# Altium project Camera-Controller-Board.PrjPcb (part 9 of 18)

## Sheet RK3588-USB-Control.SchDoc
size 420 x 297 mm; SheetNumber: 8; SheetTotal: 22
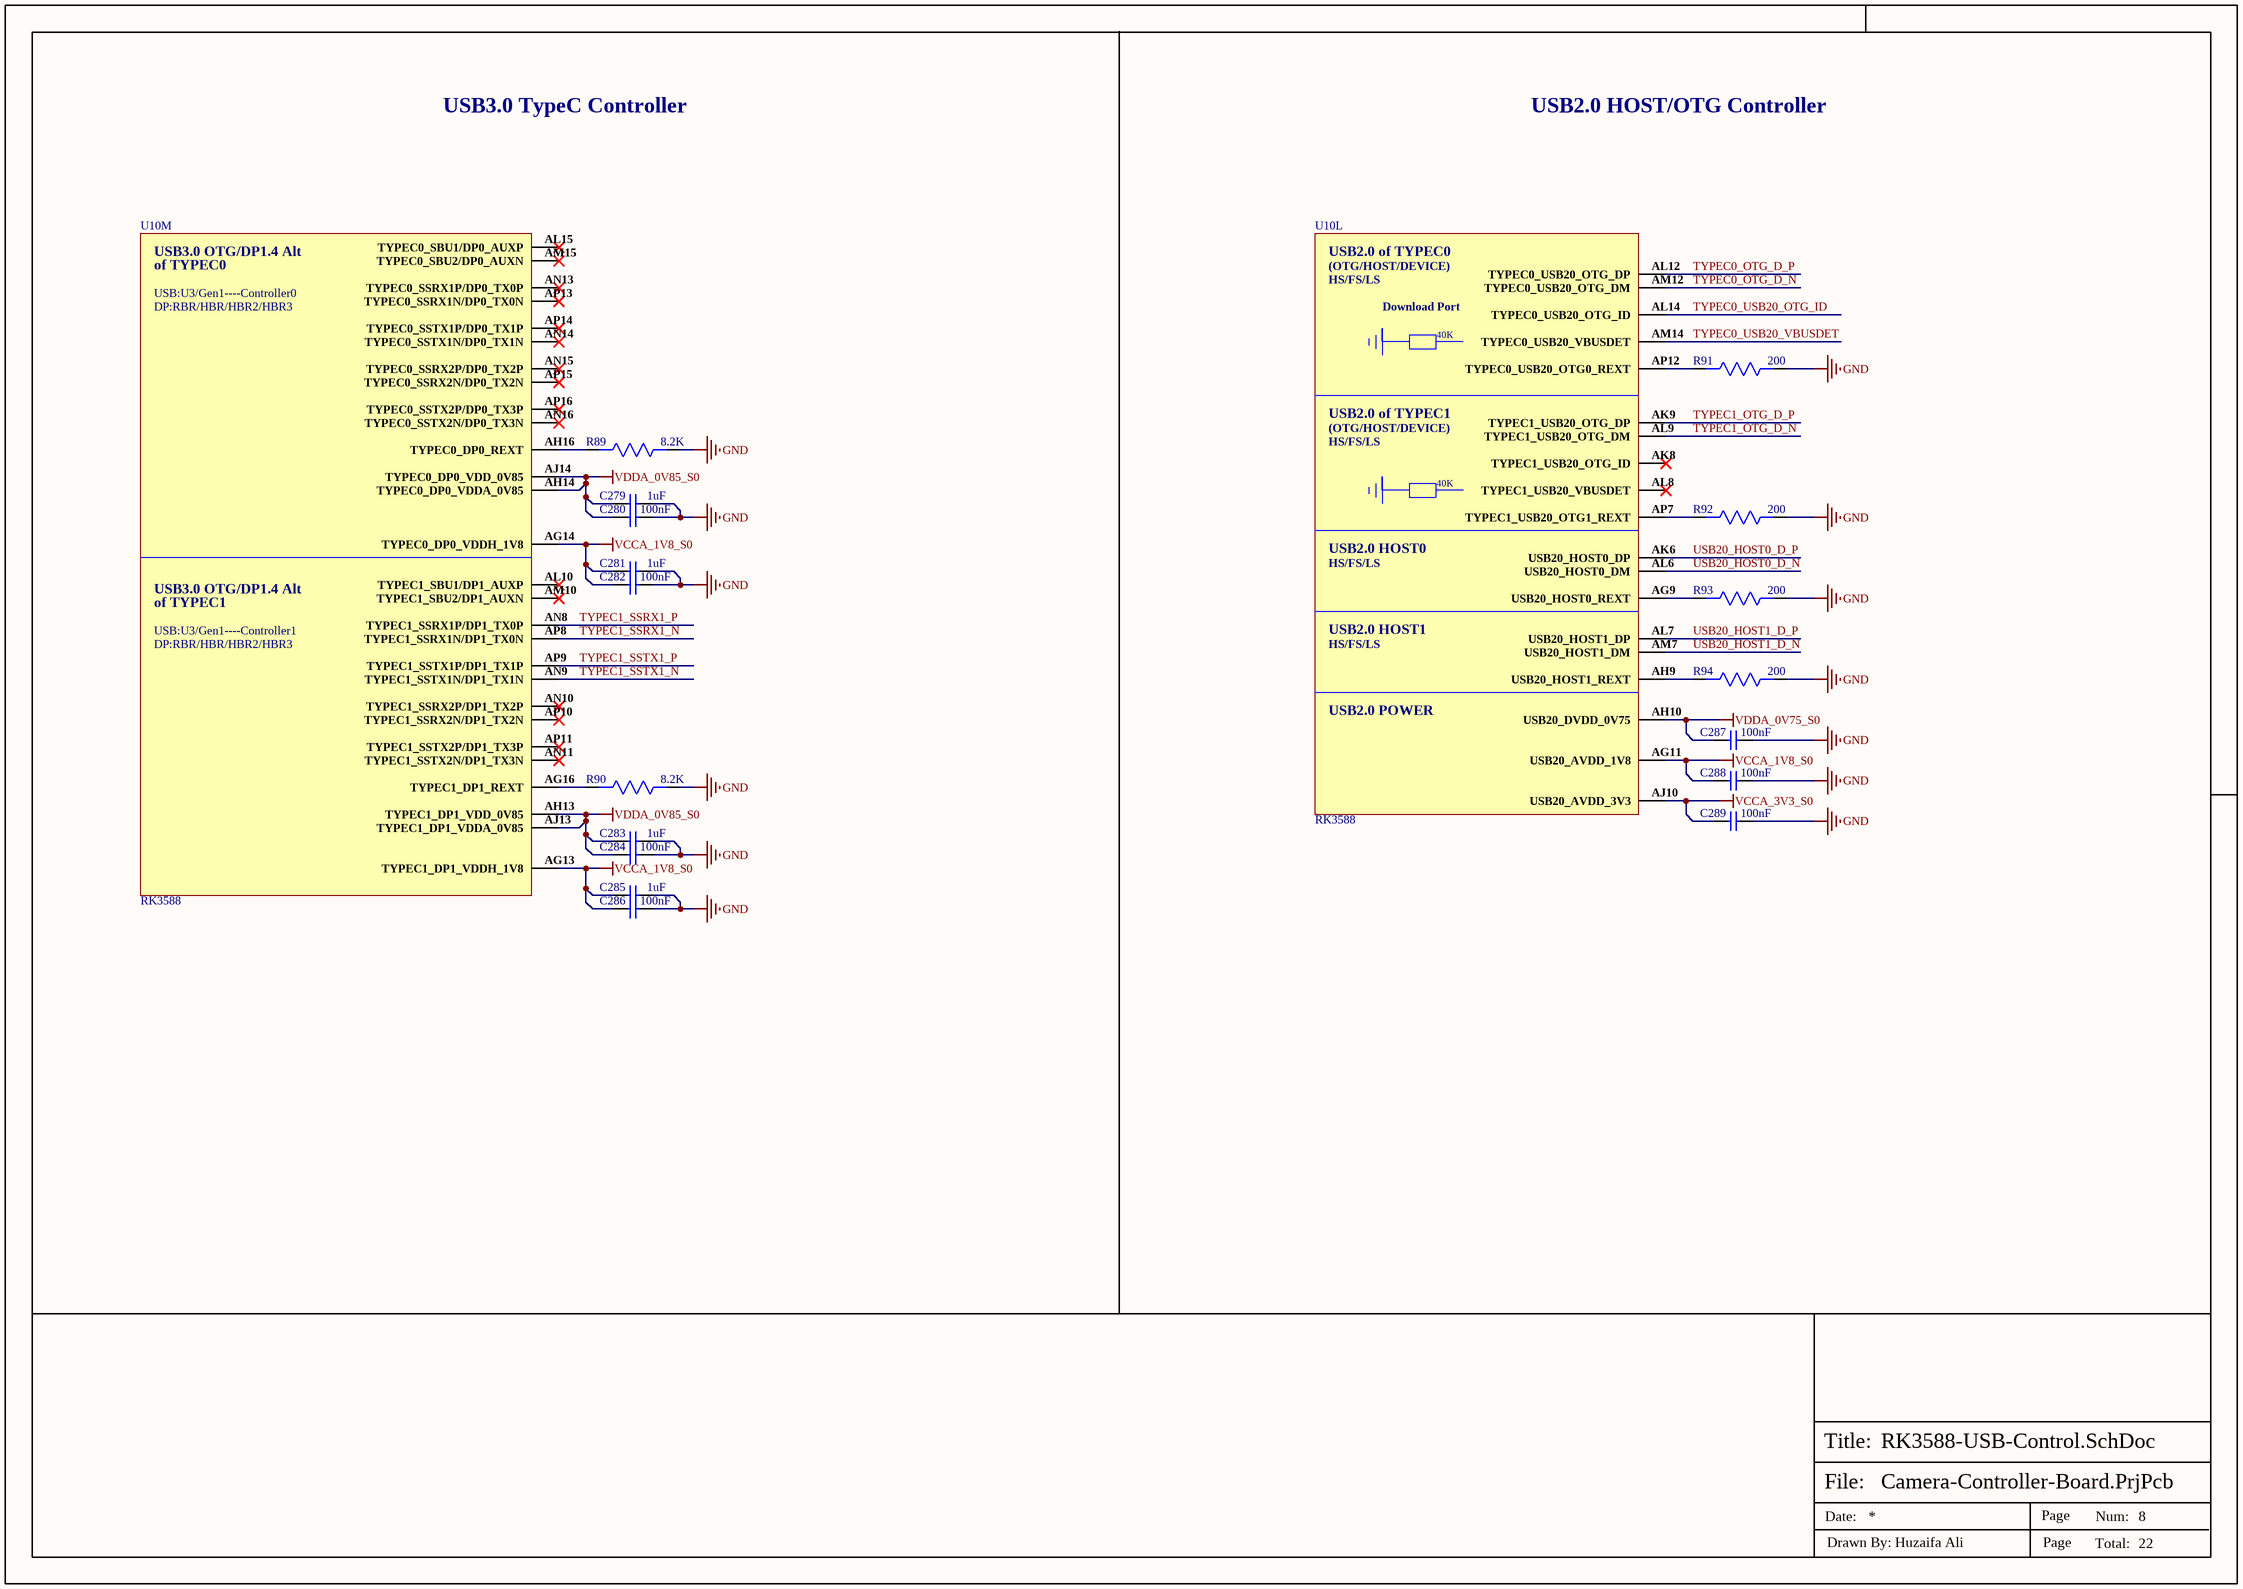
[diagram p7: RK3588-USB-Control.SchDoc]

### Parts
C279  1uF  [CAP-0201]
C280  100nF  [CAP-0201]
C281  1uF  [CAP-0201]
C282  100nF  [CAP-0201]
C283  1uF  [CAP-0201]
C284  100nF  [CAP-0201]
C285  1uF  [CAP-0201]
C286  100nF  [CAP-0201]
C287  100nF  [CAP-0201]
C288  100nF  [CAP-0201]
C289  100nF  [CAP-0201]
R89  8.2K  [Res-0201]
R90  8.2K  [Res-0201]
R91  200  [Res-0201]
R92  200  [Res-0201]
R93  200  [Res-0201]
R94  200  [Res-0201]
U10  RK3588  [FCBGA-1088L]  (parts L,M of 26)

### Nets
GND: C279.2 C280.2 C281.2 C282.2 C283.2 C284.2 C285.2 C286.2 C287.2 C288.2 C289.2 R89.1 R90.1 R91.1 R92.1 R93.1 R94.1
VCCA_1V8_S0: C281.1 C282.1 C285.1 C286.1 C288.1 U10.AG11(USB20_AVDD_1V8) U10.AG13(TYPEC1_DP1_VDDH_1V8) U10.AG14(TYPEC0_DP0_VDDH_1V8)
VCCA_3V3_S0: C289.1 U10.AJ10(USB20_AVDD_3V3)
VDDA_0V75_S0: C287.1 U10.AH10(USB20_DVDD_0V75)
VDDA_0V85_S0: C279.1 C280.1 C283.1 C284.1 U10.AH13(TYPEC1_DP1_VDD_0V85) U10.AH14(TYPEC0_DP0_VDDA_0V85) U10.AJ13(TYPEC1_DP1_VDDA_0V85) U10.AJ14(TYPEC0_DP0_VDD_0V85)
TYPEC0_OTG_D_N: U10.AM12(TYPEC0_USB20_OTG_DM)
TYPEC0_OTG_D_P: U10.AL12(TYPEC0_USB20_OTG_DP)
TYPEC0_USB20_OTG_ID: U10.AL14(TYPEC0_USB20_OTG_ID)
TYPEC0_USB20_VBUSDET: U10.AM14(TYPEC0_USB20_VBUSDET)
TYPEC1_OTG_D_N: U10.AL9(TYPEC1_USB20_OTG_DM)
TYPEC1_OTG_D_P: U10.AK9(TYPEC1_USB20_OTG_DP)
TYPEC1_SSRX1_N: U10.AP8(TYPEC1_SSRX1N/DP1_TX0N)
TYPEC1_SSRX1_P: U10.AN8(TYPEC1_SSRX1P/DP1_TX0P)
TYPEC1_SSTX1_N: U10.AN9(TYPEC1_SSTX1N/DP1_TX1N)
TYPEC1_SSTX1_P: U10.AP9(TYPEC1_SSTX1P/DP1_TX1P)
USB20_HOST0_D_N: U10.AL6(USB20_HOST0_DM)
USB20_HOST0_D_P: U10.AK6(USB20_HOST0_DP)
USB20_HOST1_D_N: U10.AM7(USB20_HOST1_DM)
USB20_HOST1_D_P: U10.AL7(USB20_HOST1_DP)
NetR89_2: R89.2 U10.AH16(TYPEC0_DP0_REXT)
NetR90_2: R90.2 U10.AG16(TYPEC1_DP1_REXT)
NetR91_2: R91.2 U10.AP12(TYPEC0_USB20_OTG0_REXT)
NetR92_2: R92.2 U10.AP7(TYPEC1_USB20_OTG1_REXT)
NetR93_2: R93.2 U10.AG9(USB20_HOST0_REXT)
NetR94_2: R94.2 U10.AH9(USB20_HOST1_REXT)

Not connected (* = marked no-connect by the designer): U10 AK8(TYPEC1_USB20_OTG_ID)* AL8(TYPEC1_USB20_VBUSDET)* AL10(TYPEC1_SBU1/DP1_AUXP)* AL15(TYPEC0_SBU1/DP0_AUXP)* AM10(TYPEC1_SBU2/DP1_AUXN)* AM15(TYPEC0_SBU2/DP0_AUXN)* AN10(TYPEC1_SSRX2P/DP1_TX2P)* AN11(TYPEC1_SSTX2N/DP1_TX3N)* AN13(TYPEC0_SSRX1P/DP0_TX0P)* AN14(TYPEC0_SSTX1N/DP0_TX1N)* AN15(TYPEC0_SSRX2P/DP0_TX2P)* AN16(TYPEC0_SSTX2N/DP0_TX3N)* AP10(TYPEC1_SSRX2N/DP1_TX2N)* AP11(TYPEC1_SSTX2P/DP1_TX3P)* AP13(TYPEC0_SSRX1N/DP0_TX0N)* AP14(TYPEC0_SSTX1P/DP0_TX1P)* AP15(TYPEC0_SSRX2N/DP0_TX2N)* AP16(TYPEC0_SSTX2P/DP0_TX3P)*

### Notes on the sheet
- USB3.0 TypeC Controller
- USB2.0 HOST/OTG Controller
- File:
- Title:
- Date:
- Page
- Num:
- Total:
- Drawn By: Huzaifa Ali
- (in symbol RK3588, part L) USB2.0 of TYPEC0; (OTG/HOST/DEVICE); HS/FS/LS; Download Port; 40K; USB2.0 of TYPEC1; USB2.0 HOST0; USB2.0 HOST1; USB2.0 POWER
- (in symbol RK3588, part M) USB3.0 OTG/DP1.4 Alt; of TYPEC0; USB:U3/Gen1----Controller0; DP:RBR/HBR/HBR2/HBR3; of TYPEC1; USB:U3/Gen1----Controller1

### Library data of the parts
C279 C281 C283 C285 = CC0201KRX5R5BB105: as C230 on sheet RK3588-OSC-PLL-PMUIO; Supplier 1: Digi-Key; Manufacturer Part Number: CC0201KRX5R5BB105; RoHS: Yes; Category: Ceramic Capacitors; Stock 1: 1909543; Pricing 1: 1=0.10000, 10=0.04600, 50=0.02500, 100=0.02050, 500=0.01464, 1000=0.01150, 2500=0.01045, 5000=0.00962 (USD); Mount: Surface Mount; Case/Package: 0201; Case Code (Imperial): 0201; Case Code (Metric): 0603; Min Operating Temperature: -55°C; Max Operating Temperature: 85°C; Packaging: Cut Tape; Capacitance: 1uF; Voltage Rating: 6.3V; RoHS Compliant: Yes; ComponentLink1URL: http://www.yageo.com/documents/recent/UPY-GPHC_X5R_4V-to-50V_25.pdf?src-supplier=Digi-Key; ComponentLink1Description: http://www.yageo.com/documents/recent/UPY-GPHC_X5R_4V-to-50V_25.pdf?src-supplier=Digi-Key; ComponentLink2URL: https://www.yageo.com/upload/media/product/productsearch/datasheet/mlcc/UPY-GPHC_X5R_4V-to-50V_26.pdf?src-supplier=Digi-Key; ComponentLink2Description: https://www.yageo.com/upload/media/product/productsearch/datasheet/mlcc/UPY-GPHC_X5R_4V-to-50V_26.pdf?src-supplier=Digi-Key; Supplier Part Number 1: 311-3471-1-ND
C280 C282 C284 C286-C289 = CC0201KRX5R5BB104: as C244 on sheet RK3588-OSC-PLL-PMUIO; Supplier 1: Digi-Key; Manufacturer Part Number: CC0201KRX5R5BB104; RoHS: Yes; Category: Ceramic Capacitors; Stock 1: 3711589; Pricing 1: 1=0.10000, 10=0.02100, 50=0.01160, 100=0.00960, 500=0.00682, 1000=0.00536, 2500=0.00487, 5000=0.00448 (USD); Mount: Surface Mount; Case/Package: 0201; Number of Pins: 2; Case Code (Imperial): 0201; Case Code (Metric): 0603; Min Operating Temperature: -55°C; Max Operating Temperature: 85°C; Capacitance: 100nF; Dielectric: X5R; Voltage Rating: 6.3V; Packaging: Tape and Reel; Package Quantity: 1; Voltage Rating (DC): 6.3V; Termination: SMD/SMT; Resistor Type: Ceramic; Series: CC; Length: 0.6mm; Width: 0.012inch; Height: 0.3mm; Thickness: 0.013inch; Depth: 0.3mm; Reach SVHC Compliant: Yes; Lead Free: Lead Free; Halogen Free: Halogen Free; RoHS Compliant: Yes; ComponentLink1URL: https://datasheet.ciiva.com/7656/1525783-7656597.pdf?src-supplier=Element14; ComponentLink1Description: https://datasheet.ciiva.com/7656/1525783-7656597.pdf?src-supplier=Element14; ComponentLink2URL: https://datasheet.ciiva.com/28450/1359354-28450200.pdf?src-supplier=Element14; ComponentLink2Description: https://datasheet.ciiva.com/28450/1359354-28450200.pdf?src-supplier=Element14; ComponentLink3URL: https://datasheet.ciiva.com/176/mlccorderingcode-176766.pdf?src-supplier=Digi-Key; ComponentLink3Description: https://datasheet.ciiva.com/176/mlccorderingcode-176766.pdf?src-supplier=Digi-Key; ComponentLink4URL: https://datasheet.ciiva.com/176/mlccorderingcode-176765.pdf?src-supplier=Digi-Key; ComponentLink4Description: https://datasheet.ciiva.com/176/mlccorderingcode-176765.pdf?src-supplier=Digi-Key; ComponentLink5URL: https://datasheet.ciiva.com/176/mlccorderingcode-176767.pdf?src-supplier=Digi-Key; ComponentLink5Description: https://datasheet.ciiva.com/176/mlccorderingcode-176767.pdf?src-supplier=Digi-Key; Supplier Part Number 1: 311-1408-1-ND
R89 R90 = RC0201FR-078K2L: RES 8.2K OHM 1% 1/20W 0201; Manufacturer: Yageo; Resistance: 8.2kR; Power Rating: 50mW; Voltage Rating: 25V; Temperature Coefficient: 200ppm/°C; Supplier 1: Digi-Key; Manufacturer Part Number: RC0201FR-078K2L; RoHS: Yes; Category: Chip SMD Resistors; Stock 1: 282340; Pricing 1: 1=0.10000, 10=0.03700, 100=0.01500, 1000=0.00672, 2500=0.00583, 5000=0.00482 (USD); Case/Package: 0201; Case Code (Metric): 0603; Case Code (Imperial): 0201; Min Operating Temperature: -55°C; Max Operating Temperature: 125°C; Package Quantity: 10000; Packaging: Tape and Reel; Tolerance: 1%; Resistor Type: Thick Film; Number of Terminations: 2; Termination: SMD/SMT; Max Power Dissipation: 50mW; Features: Moisture Resistant; Series: RC; Resistance Tolerance: 1%; Length: 0.024inch; Width: 0.3mm; Height: 0.01inch; Reach SVHC Compliant: Yes; Lead Free: Lead Free; RoHS Compliant: Yes; ComponentLink1URL: https://datasheet.ciiva.com/14985/pyu-r-int-thick-7-14985436.pdf?src-supplier=Digi-Key; ComponentLink1Description: https://datasheet.ciiva.com/14985/pyu-r-int-thick-7-14985436.pdf?src-supplier=Digi-Key; Supplier Part Number 1: YAG2353CT-ND
R91-R94 = RC0201FR-07200RL: RES 200 OHM 1% 1/20W 0201; Manufacturer: Yageo; Resistance: 200R; Voltage Rating: 25V; Power Rating: 50mW; Temperature Coefficient: 200ppm/°C; Supplier 1: Digi-Key; Manufacturer Part Number: RC0201FR-07200RL; RoHS: Yes; Category: Chip SMD Resistors; Stock 1: 400402; Pricing 1: 1=0.10000, 10=0.03700, 100=0.01500, 1000=0.00672, 2500=0.00583, 5000=0.00482 (USD); Case/Package: 0201; Case Code (Imperial): 0201; Case Code (Metric): 0603; Size Code: 0201; Min Operating Temperature: -55°C; Max Operating Temperature: 125°C; Package Quantity: 10000; Tolerance: 1%; Packaging: Tape and Reel; Resistor Type: Thick Film; Termination: SMD/SMT; Number of Terminations: 2; Max Power Dissipation: 50mW; Features: Moisture Resistant; Series: RC; Construction: Rectangular; Length: 0.6mm; Width: 0.3mm; Height: 0.01inch; Depth: 0.3mm; Military Standard: Not; Lead Free: Lead Free; RoHS Compliant: Yes; ComponentLink1URL: http://www.mouser.com/ds/2/447/RC0201-559633.pdf?src-supplier=Mouser; ComponentLink1Description: http://www.mouser.com/ds/2/447/RC0201-559633.pdf?src-supplier=Mouser; ComponentLink2URL: http://www.yageo.com/documents/recent/PYu-RC0201_51_RoHS_L_(8).pdf?src-supplier=Future+Electronics; ComponentLink2Description: http://www.yageo.com/documents/recent/PYu-RC0201_51_RoHS_L_(8).pdf?src-supplier=Future+Electronics; ComponentLink3URL: http://www.yageo.com/documents/recent/PYu-RC_Group_51_RoHS_L_10.pdf?src-supplier=Digi-Key; ComponentLink3Description: http://www.yageo.com/documents/recent/PYu-RC_Group_51_RoHS_L_10.pdf?src-supplier=Digi-Key; ComponentLink4URL: http://www.yageo.com/documents/recent/PYu-RC_Group_51_RoHS_L_9.pdf?src-supplier=Digi-Key; ComponentLink4Description: http://www.yageo.com/documents/recent/PYu-RC_Group_51_RoHS_L_9.pdf?src-supplier=Digi-Key; Supplier Part Number 1: YAG2495CT-ND
U10 = RK3588: as U10 on sheet RK3588-OSC-PLL-PMUIO; LCSC Part Number: *; Item Type: IC

## Sheet RK3588-SARADC.SchDoc
size 420 x 297 mm; SheetNumber: 9; SheetTotal: 22
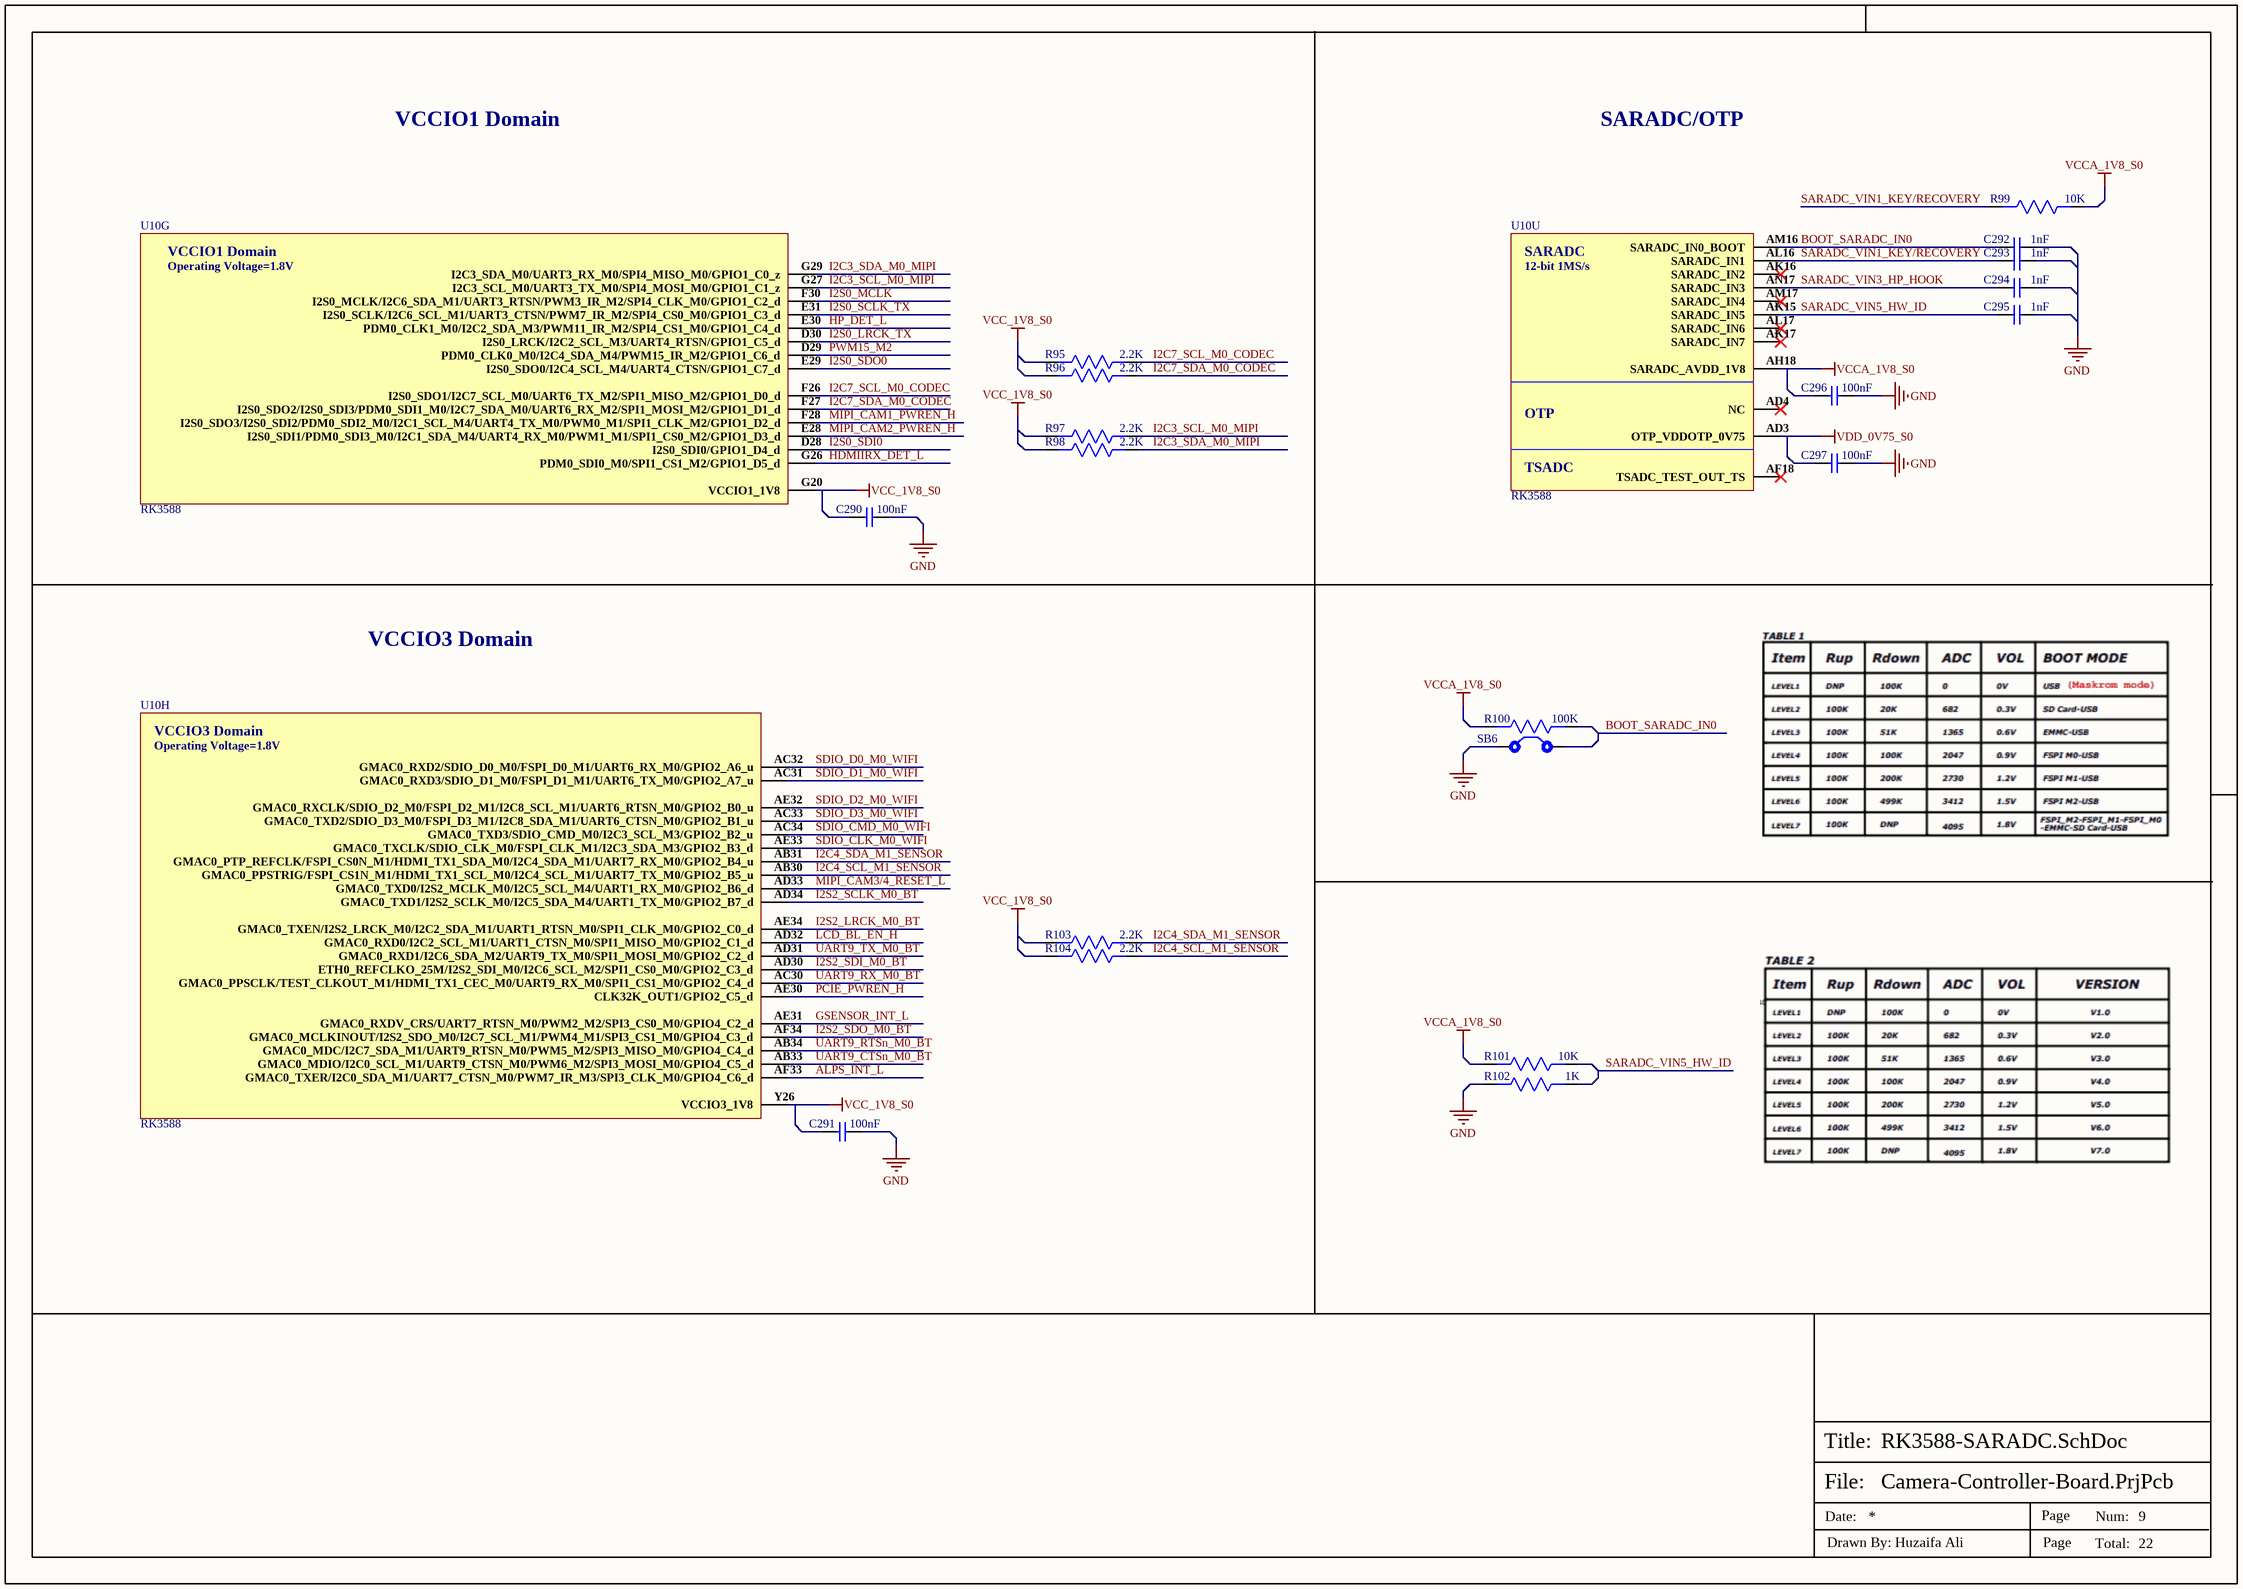
[diagram p8: RK3588-SARADC.SchDoc]

### Parts
C290  100nF  [CAP-0201]
C291  100nF  [CAP-0201]
C292  1nF  [Cap-0402]
C293  1nF  [Cap-0402]
C294  1nF  [Cap-0402]
C295  1nF  [Cap-0402]
C296  100nF  [CAP-0201]
C297  100nF  [CAP-0201]
R95  2.2K  [Res-0201]
R96  2.2K  [Res-0201]
R97  2.2K  [Res-0201]
R98  2.2K  [Res-0201]
R99  10K  [Res-0402]
R100  100K  [Res-0402]
R101  10K  [Res-0402]
R102  1K  [Res-0402]
R103  2.2K  [Res-0201]
R104  2.2K  [Res-0201]
SB6  Solder Bridge  [Solder Bridge]  (value not drawn)
U10  RK3588  [FCBGA-1088L]  (parts G,H,U of 26)

### Nets
GND: C290.2 C291.2 C292.2 C293.2 C294.2 C295.2 C296.2 C297.2 R102.2 SB6.1
VCC_1V8_S0: C290.1 C291.1 R95.2 R96.2 R97.2 R98.2 R103.2 R104.2 U10.G20(VCCIO1_1V8) U10.Y26(VCCIO3_1V8)
VCCA_1V8_S0: C296.1 R99.1 R100.2 R101.2 U10.AH18(SARADC_AVDD_1V8)
VDD_0V75_S0: C297.1 U10.AD3(OTP_VDDOTP_0V75)
ALPS_INT_L: U10.AF33(GMAC0_TXER/I2C0_SDA_M1/UART7_CTSN_M0/PWM7_IR_M3/SPI3_CLK_M0/GPIO4_C6_d)
BOOT_SARADC_IN0: C292.1 R100.1 SB6.2 U10.AM16(SARADC_IN0_BOOT)
GSENSOR_INT_L: U10.AE31(GMAC0_RXDV_CRS/UART7_RTSN_M0/PWM2_M2/SPI3_CS0_M0/GPIO4_C2_d)
HDMIIRX_DET_L: U10.G26(PDM0_SDI0_M0/SPI1_CS1_M2/GPIO1_D5_d)
HP_DET_L: U10.E30(PDM0_CLK1_M0/I2C2_SDA_M3/PWM11_IR_M2/SPI4_CS1_M0/GPIO1_C4_d)
I2C3_SCL_M0_MIPI: R97.1 U10.G27(I2C3_SCL_M0/UART3_TX_M0/SPI4_MOSI_M0/GPIO1_C1_z)
I2C3_SDA_M0_MIPI: R98.1 U10.G29(I2C3_SDA_M0/UART3_RX_M0/SPI4_MISO_M0/GPIO1_C0_z)
I2C4_SCL_M1_SENSOR: R104.1 U10.AB30(GMAC0_PPSTRIG/FSPI_CS1N_M1/HDMI_TX1_SCL_M0/I2C4_SCL_M1/UART7_TX_M0/GPIO2_B5_u)
I2C4_SDA_M1_SENSOR: R103.1 U10.AB31(GMAC0_PTP_REFCLK/FSPI_CS0N_M1/HDMI_TX1_SDA_M0/I2C4_SDA_M1/UART7_RX_M0/GPIO2_B4_u)
I2C7_SCL_M0_CODEC: R95.1 U10.F26(I2S0_SDO1/I2C7_SCL_M0/UART6_TX_M2/SPI1_MISO_M2/GPIO1_D0_d)
I2C7_SDA_M0_CODEC: R96.1 U10.F27(I2S0_SDO2/I2S0_SDI3/PDM0_SDI1_M0/I2C7_SDA_M0/UART6_RX_M2/SPI1_MOSI_M2/GPIO1_D1_d)
I2S0_LRCK_TX: U10.D30(I2S0_LRCK/I2C2_SCL_M3/UART4_RTSN/GPIO1_C5_d)
I2S0_MCLK: U10.F30(I2S0_MCLK/I2C6_SDA_M1/UART3_RTSN/PWM3_IR_M2/SPI4_CLK_M0/GPIO1_C2_d)
I2S0_SCLK_TX: U10.E31(I2S0_SCLK/I2C6_SCL_M1/UART3_CTSN/PWM7_IR_M2/SPI4_CS0_M0/GPIO1_C3_d)
I2S0_SDI0: U10.D28(I2S0_SDI0/GPIO1_D4_d)
I2S0_SDO0: U10.E29(I2S0_SDO0/I2C4_SCL_M4/UART4_CTSN/GPIO1_C7_d)
I2S2_LRCK_M0_BT: U10.AE34(GMAC0_TXEN/I2S2_LRCK_M0/I2C2_SDA_M1/UART1_RTSN_M0/SPI1_CLK_M0/GPIO2_C0_d)
I2S2_SCLK_M0_BT: U10.AD34(GMAC0_TXD1/I2S2_SCLK_M0/I2C5_SDA_M4/UART1_TX_M0/GPIO2_B7_d)
I2S2_SDI_M0_BT: U10.AD30(ETH0_REFCLKO_25M/I2S2_SDI_M0/I2C6_SCL_M2/SPI1_CS0_M0/GPIO2_C3_d)
I2S2_SDO_M0_BT: U10.AF34(GMAC0_MCLKINOUT/I2S2_SDO_M0/I2C7_SCL_M1/PWM4_M1/SPI3_CS1_M0/GPIO4_C3_d)
LCD_BL_EN_H: U10.AD32(GMAC0_RXD0/I2C2_SCL_M1/UART1_CTSN_M0/SPI1_MISO_M0/GPIO2_C1_d)
MIPI_CAM1_PWREN_H: U10.F28(I2S0_SDO3/I2S0_SDI2/PDM0_SDI2_M0/I2C1_SCL_M4/UART4_TX_M0/PWM0_M1/SPI1_CLK_M2/GPIO1_D2_d)
MIPI_CAM2_PWREN_H: U10.E28(I2S0_SDI1/PDM0_SDI3_M0/I2C1_SDA_M4/UART4_RX_M0/PWM1_M1/SPI1_CS0_M2/GPIO1_D3_d)
MIPI_CAM3/4_RESET_L: U10.AD33(GMAC0_TXD0/I2S2_MCLK_M0/I2C5_SCL_M4/UART1_RX_M0/GPIO2_B6_d)
PCIE_PWREN_H: U10.AE30(CLK32K_OUT1/GPIO2_C5_d)
PWM15_M2: U10.D29(PDM0_CLK0_M0/I2C4_SDA_M4/PWM15_IR_M2/GPIO1_C6_d)
SARADC_VIN1_KEY/RECOVERY: C293.1 R99.2 U10.AL16(SARADC_IN1)
SARADC_VIN3_HP_HOOK: C294.1 U10.AN17(SARADC_IN3)
SARADC_VIN5_HW_ID: C295.1 R101.1 R102.1 U10.AK15(SARADC_IN5)
SDIO_CLK_M0_WIFI: U10.AE33(GMAC0_TXCLK/SDIO_CLK_M0/FSPI_CLK_M1/I2C3_SDA_M3/GPIO2_B3_d)
SDIO_CMD_M0_WIFI: U10.AC34(GMAC0_TXD3/SDIO_CMD_M0/I2C3_SCL_M3/GPIO2_B2_u)
SDIO_D0_M0_WIFI: U10.AC32(GMAC0_RXD2/SDIO_D0_M0/FSPI_D0_M1/UART6_RX_M0/GPIO2_A6_u)
SDIO_D1_M0_WIFI: U10.AC31(GMAC0_RXD3/SDIO_D1_M0/FSPI_D1_M1/UART6_TX_M0/GPIO2_A7_u)
SDIO_D2_M0_WIFI: U10.AE32(GMAC0_RXCLK/SDIO_D2_M0/FSPI_D2_M1/I2C8_SCL_M1/UART6_RTSN_M0/GPIO2_B0_u)
SDIO_D3_M0_WIFI: U10.AC33(GMAC0_TXD2/SDIO_D3_M0/FSPI_D3_M1/I2C8_SDA_M1/UART6_CTSN_M0/GPIO2_B1_u)
UART9_CTSn_M0_BT: U10.AB33(GMAC0_MDIO/I2C0_SCL_M1/UART9_CTSN_M0/PWM6_M2/SPI3_MOSI_M0/GPIO4_C5_d)
UART9_RTSn_M0_BT: U10.AB34(GMAC0_MDC/I2C7_SDA_M1/UART9_RTSN_M0/PWM5_M2/SPI3_MISO_M0/GPIO4_C4_d)
UART9_RX_M0_BT: U10.AC30(GMAC0_PPSCLK/TEST_CLKOUT_M1/HDMI_TX1_CEC_M0/UART9_RX_M0/SPI1_CS1_M0/GPIO2_C4_d)
UART9_TX_M0_BT: U10.AD31(GMAC0_RXD1/I2C6_SDA_M2/UART9_TX_M0/SPI1_MOSI_M0/GPIO2_C2_d)

Not connected (* = marked no-connect by the designer): U10 AD4(NC)* AF18(TSADC_TEST_OUT_TS)* AK16(SARADC_IN2)* AK17(SARADC_IN7)* AL17(SARADC_IN6)* AM17(SARADC_IN4)*

### Notes on the sheet
- VCCIO1 Domain
- SARADC/OTP
- VCCIO3 Domain
- File:
- Title:
- Date:
- Page
- Num:
- Total:
- Drawn By: Huzaifa Ali
- (in symbol RK3588, part G) VCCIO1 Domain; Operating Voltage=1.8V
- (in symbol RK3588, part H) VCCIO3 Domain; Operating Voltage=1.8V
- (in symbol RK3588, part U) SARADC; 12-bit 1MS/s; OTP; TSADC

### Library data of the parts
C290 C291 C296 C297 = CC0201KRX5R5BB104: as C244 on sheet RK3588-OSC-PLL-PMUIO; Supplier 1: Digi-Key; Manufacturer Part Number: CC0201KRX5R5BB104; RoHS: Yes; Category: Ceramic Capacitors; Stock 1: 3711589; Pricing 1: 1=0.10000, 10=0.02100, 50=0.01160, 100=0.00960, 500=0.00682, 1000=0.00536, 2500=0.00487, 5000=0.00448 (USD); Mount: Surface Mount; Case/Package: 0201; Number of Pins: 2; Case Code (Imperial): 0201; Case Code (Metric): 0603; Min Operating Temperature: -55°C; Max Operating Temperature: 85°C; Capacitance: 100nF; Dielectric: X5R; Voltage Rating: 6.3V; Packaging: Tape and Reel; Package Quantity: 1; Voltage Rating (DC): 6.3V; Termination: SMD/SMT; Resistor Type: Ceramic; Series: CC; Length: 0.6mm; Width: 0.012inch; Height: 0.3mm; Thickness: 0.013inch; Depth: 0.3mm; Reach SVHC Compliant: Yes; Lead Free: Lead Free; Halogen Free: Halogen Free; RoHS Compliant: Yes; ComponentLink1URL: https://datasheet.ciiva.com/7656/1525783-7656597.pdf?src-supplier=Element14; ComponentLink1Description: https://datasheet.ciiva.com/7656/1525783-7656597.pdf?src-supplier=Element14; ComponentLink2URL: https://datasheet.ciiva.com/28450/1359354-28450200.pdf?src-supplier=Element14; ComponentLink2Description: https://datasheet.ciiva.com/28450/1359354-28450200.pdf?src-supplier=Element14; ComponentLink3URL: https://datasheet.ciiva.com/176/mlccorderingcode-176766.pdf?src-supplier=Digi-Key; ComponentLink3Description: https://datasheet.ciiva.com/176/mlccorderingcode-176766.pdf?src-supplier=Digi-Key; ComponentLink4URL: https://datasheet.ciiva.com/176/mlccorderingcode-176765.pdf?src-supplier=Digi-Key; ComponentLink4Description: https://datasheet.ciiva.com/176/mlccorderingcode-176765.pdf?src-supplier=Digi-Key; ComponentLink5URL: https://datasheet.ciiva.com/176/mlccorderingcode-176767.pdf?src-supplier=Digi-Key; ComponentLink5Description: https://datasheet.ciiva.com/176/mlccorderingcode-176767.pdf?src-supplier=Digi-Key; Supplier Part Number 1: 311-1408-1-ND
C292-C295 = GRM1555C1H102JA01D: CAP CER 1000PF 50V C0G/NP0 0402; Manufacturer: Murata; Material: Ceramic; Tolerance: 5%; Dielectric: C0G; Insulation Resistance: 10GR; Temperature Coefficient: 30ppm/°C; Item Type: Capacitor; Supplier 1: Avnet; Manufacturer Part Number: GRM1555C1H102JA01D; RoHS: Yes; Category: Ceramic Capacitors; Stock 1: 800000; Pricing 1: 10000=0.00648, 20000=0.00613, 40000=0.00578, 60000=0.00543, 80000=0.00508, 100000=0.00473, 1000000=0.00438 (USD); Mount: Surface Mount; Case/Package: 0402; Number of Pins: 2; Case Code (Metric): 1005; Case Code (Imperial): 0402; Dielectric Material: Ceramic; Min Operating Temperature: -55°C; Max Operating Temperature: 125°C; Package Quantity: 1; Capacitance: 1nF; Voltage Rating: 50V; Packaging: Tape and Reel; Voltage Rating (DC): 50V; Termination: SMD/SMT; Voltage: 50V; Series: GRM; Construction: Flat; Length: 1mm; Width: 0.5mm; Height: 0.5mm; Thickness: 0.022inch; Depth: 0.5mm; Size: 0.5mm; Radiation Hardening: No; Reach SVHC Compliant: Yes; Lead Free: Lead Free; RoHS Compliant: Yes; ComponentLink1URL: https://datasheet.ciiva.com/34302/1855908-34302849.pdf?src-supplier=Jameco; ComponentLink1Description: https://datasheet.ciiva.com/34302/1855908-34302849.pdf?src-supplier=Jameco; ComponentLink2URL: https://datasheet.ciiva.com/132/product-132800.pdf?src-supplier=Digi-Key; ComponentLink2Description: https://datasheet.ciiva.com/132/product-132800.pdf?src-supplier=Digi-Key; ComponentLink3URL: https://datasheet.ciiva.com/132/grm1555c1h102ja01-01-132799.pdf?src-supplier=Digi-Key; ComponentLink3Description: https://datasheet.ciiva.com/132/grm1555c1h102ja01-01-132799.pdf?src-supplier=Digi-Key; ComponentLink4URL: https://datasheet.ciiva.com/11786/0900766b807a1cab-11786727.pdf?src-supplier=RSComponents; ComponentLink4Description: https://datasheet.ciiva.com/11786/0900766b807a1cab-11786727.pdf?src-supplier=RSComponents; ComponentLink5URL: https://datasheet.ciiva.com/29200/453569-da-01-en-vs-kondensator-0402-29200121.pdf?src-supplier=Conrad; ComponentLink5Description: https://datasheet.ciiva.com/29200/453569-da-01-en-vs-kondensator-0402-29200121.pdf?src-supplier=Conrad; ComponentLink6URL: https://datasheet.ciiva.com/7828/4360-7828821.pdf?src-supplier=Element14; ComponentLink6Description: https://datasheet.ciiva.com/7828/4360-7828821.pdf?src-supplier=Element14; ComponentLink7URL: https://datasheet.ciiva.com/14116/grmseries-tc-hitype-eng-14116919.pdf?src-supplier=Distrelec; ComponentLink7Description: https://datasheet.ciiva.com/14116/grmseries-tc-hitype-eng-14116919.pdf?src-supplier=Distrelec; ComponentLink8URL: https://datasheet.ciiva.com/14116/grmseries-tc-hitype-eng-14116858.pdf?src-supplier=Distrelec; ComponentLink8Description: https://datasheet.ciiva.com/14116/grmseries-tc-hitype-eng-14116858.pdf?src-supplier=Distrelec; ComponentLink9URL: https://datasheet.ciiva.com/132/grm1555c1h102ja01-01-132801.pdf?src-supplier=Digi-Key; ComponentLink9Description: https://datasheet.ciiva.com/132/grm1555c1h102ja01-01-132801.pdf?src-supplier=Digi-Key; ComponentLink10URL: https://datasheet.ciiva.com/7828/1747436-7828822.pdf?src-supplier=Element14; ComponentLink10Description: https://datasheet.ciiva.com/7828/1747436-7828822.pdf?src-supplier=Element14; Supplier Part Number 1: GRM1555C1H102JA01D; LCSC Part Number: C76947
R95-R98 R103 R104 = RC0201FR-072K2L: as R69 on sheet RK3588-OSC-PLL-PMUIO; Supplier 1: Digi-Key; Manufacturer Part Number: RC0201FR-072K2L; RoHS: Yes; Category: Chip SMD Resistors; Stock 1: 1171924; Pricing 1: 1=0.10000, 10=0.03700, 100=0.01500, 1000=0.00672, 2500=0.00583, 5000=0.00482 (USD); Case/Package: 0201; Case Code (Imperial): 0201; Case Code (Metric): 0603; Size Code: 0201; Min Operating Temperature: -55°C; Max Operating Temperature: 125°C; Tolerance: 1%; Packaging: Tape and Reel; Resistor Type: Thick Film; Number of Terminations: 2; Termination: SMD/SMT; Max Power Dissipation: 50mW; Features: Moisture Resistant; Series: RC; Resistance Tolerance: 1%; Construction: Rectangular; Length: 0.024inch; Width: 0.3mm; Height: 0.01inch; Depth: 0.3mm; Military Standard: Not; Lead Free: Lead Free; RoHS Compliant: Yes; ComponentLink1URL: https://datasheet.ciiva.com/7672/1563626-7672218.pdf?src-supplier=Element14; ComponentLink1Description: https://datasheet.ciiva.com/7672/1563626-7672218.pdf?src-supplier=Element14; Supplier Part Number 1: YAG2572CT-ND
R99 R101 = RC0402FR-0710KL: RES 10K OHM 1% 1/16W 0402; Manufacturer: Yageo; Resistance: 10kR; Voltage Rating (DC): 50V; Temperature Coefficient: 100ppm/°C; Power Rating: 62.5mW; Max Power Dissipation: 63mW; Supplier 1: Mouser; Manufacturer Part Number: RC0402FR-0710KL; RoHS: Yes; Category: Chip SMD Resistors; Stock 1: 18648329; Pricing 1: 1=0.10000, 10=0.01400, 50=0.01400, 100=0.00500, 1000=0.00300, 10000=0.00200 (USD); Case/Package: 0402; Number of Pins: 2; Case Code (Imperial): 0402; Case Code (Metric): 1005; Min Operating Temperature: -55°C; Max Operating Temperature: 155°C; Resistor Type: Thick Film; Tolerance: 1%; Packaging: Tape and Reel; Voltage Rating: 50V; Termination: SMD/SMT; Working Voltage: 50V; Number of Terminations: 2; Features: Moisture Resistant; Series: RC; Resistance Tolerance: 1%; Construction: Rectangular; Length: 1mm; Width: 0.5mm; Height: 0.32mm; Depth: 0.5mm; Lead Pitch: 0.2mm; REACH SVHC: No SVHC; Lead Free: Lead Free; RoHS Compliant: Yes; Military Standard: Not; ComponentLink1URL: https://datasheet.ciiva.com/7660/38568-7660787.pdf?src-supplier=Element14; ComponentLink1Description: https://datasheet.ciiva.com/7660/38568-7660787.pdf?src-supplier=Element14; ComponentLink2URL: https://datasheet.ciiva.com/7849/1686128-7849814.pdf?src-supplier=Element14; ComponentLink2Description: https://datasheet.ciiva.com/7849/1686128-7849814.pdf?src-supplier=Element14; ComponentLink3URL: https://datasheet.ciiva.com/7983/1018594-7983486.pdf?src-supplier=Element14; ComponentLink3Description: https://datasheet.ciiva.com/7983/1018594-7983486.pdf?src-supplier=Element14; ComponentLink4URL: https://datasheet.ciiva.com/22747/1018594-22747512.pdf?src-supplier=Element14; ComponentLink4Description: https://datasheet.ciiva.com/22747/1018594-22747512.pdf?src-supplier=Element14; ComponentLink5URL: https://datasheet.ciiva.com/12667/pyu-rc0402-51-rohs-l-6-r-12667067.pdf?src-supplier=Mouser; ComponentLink5Description: https://datasheet.ciiva.com/12667/pyu-rc0402-51-rohs-l-6-r-12667067.pdf?src-supplier=Mouser; ComponentLink6URL: https://datasheet.ciiva.com/7849/1784430-7849813.pdf?src-supplier=Element14; ComponentLink6Description: https://datasheet.ciiva.com/7849/1784430-7849813.pdf?src-supplier=Element14; ComponentLink7URL: https://datasheet.ciiva.com/7849/1784430-7849815.pdf?src-supplier=Element14; ComponentLink7Description: https://datasheet.ciiva.com/7849/1784430-7849815.pdf?src-supplier=Element14; Supplier Part Number 1: 603-RC0402FR-0710KL; LCSC Part Number: C60490
R100 = RC0402FR-07100KL: as R76 on sheet RK3588-OSC-PLL-PMUIO; Supplier 1: Mouser; Manufacturer Part Number: RC0402FR-07100KL; RoHS: Yes; Category: Chip SMD Resistors; Stock 1: 7759549; Pricing 1: 1=0.10000, 10=0.01200, 50=0.01200, 100=0.00500, 1000=0.00300, 2500=0.00200, 10000=0.00100 (USD); Case/Package: 0402; Case Code (Metric): 1005; Case Code (Imperial): 0402; Min Operating Temperature: -55°C; Max Operating Temperature: 155°C; Resistor Type: Thick Film; Tolerance: 1%; Packaging: Tape and Reel; Package Quantity: 1; Number of Terminations: 2; Termination: SMD/SMT; Max Power Dissipation: 63mW; Working Voltage: 50V; Features: Moisture Resistant; Series: RC; Resistance Tolerance: 1%; Construction: Rectangular; Technology: THICK FILM; Length: 0.039inch; Width: 0.02inch; Height: 0.016inch; Depth: 0.5mm; REACH SVHC: No SVHC; Lead Free: Lead Free; RoHS Compliant: Yes; Military Standard: Not; ComponentLink1URL: https://datasheet.ciiva.com/11819/0900766b80c66297-11819452.pdf?src-supplier=RSComponents; ComponentLink1Description: https://datasheet.ciiva.com/11819/0900766b80c66297-11819452.pdf?src-supplier=RSComponents; ComponentLink2URL: https://datasheet.ciiva.com/22747/1018594-22747509.pdf?src-supplier=Element14; ComponentLink2Description: https://datasheet.ciiva.com/22747/1018594-22747509.pdf?src-supplier=Element14; ComponentLink3URL: https://datasheet.ciiva.com/2453/pyu-r-int-thick-7-2453362.pdf?src-supplier=Digi-Key; ComponentLink3Description: https://datasheet.ciiva.com/2453/pyu-r-int-thick-7-2453362.pdf?src-supplier=Digi-Key; ComponentLink4URL: https://datasheet.ciiva.com/2453/pyu-r-int-thick-7-2453363.pdf?src-supplier=Digi-Key; ComponentLink4Description: https://datasheet.ciiva.com/2453/pyu-r-int-thick-7-2453363.pdf?src-supplier=Digi-Key; ComponentLink5URL: https://datasheet.ciiva.com/2453/pyu-r-int-thick-7-2453361.pdf?src-supplier=Digi-Key; ComponentLink5Description: https://datasheet.ciiva.com/2453/pyu-r-int-thick-7-2453361.pdf?src-supplier=Digi-Key; ComponentLink6URL: https://datasheet.ciiva.com/12667/pyu-rc0402-51-rohs-l-6-r-12667930.pdf?src-supplier=Mouser; ComponentLink6Description: https://datasheet.ciiva.com/12667/pyu-rc0402-51-rohs-l-6-r-12667930.pdf?src-supplier=Mouser; ComponentLink7URL: https://datasheet.ciiva.com/15189/getdatasheetpartid-323696-15189334.pdf?src-supplier=Verical; ComponentLink7Description: https://datasheet.ciiva.com/15189/getdatasheetpartid-323696-15189334.pdf?src-supplier=Verical; Supplier Part Number 1: 603-RC0402FR-07100KL
R102 = RC0402FR-071KL: RES 1K OHM 1% 1/16W 0402; Manufacturer: Yageo; Resistance: 1kR; Temperature Coefficient: 100ppm/°C; Voltage Rating (DC): 50V; Power Rating: 62.5mW; Max Power Dissipation: 63mW; Supplier 1: Digi-Key; Manufacturer Part Number: RC0402FR-071KL; RoHS: Yes; Category: Chip SMD Resistors; Stock 1: 36618273; Pricing 1: 1=0.10000, 10=0.01400, 100=0.00580, 1000=0.00262, 2500=0.00228, 5000=0.00188 (USD); Case/Package: 0402; Number of Pins: 2; Case Code (Imperial): 0402; Case Code (Metric): 1005; Size Code: 0402; Min Operating Temperature: -55°C; Max Operating Temperature: 155°C; Resistor Type: Thick Film; Tolerance: 1%; Packaging: Tape and Reel; Voltage Rating: 50V; Termination: SMD/SMT; Features: Moisture Resistant; Series: RC; Number of Terminations: 2; Resistance Tolerance: 1%; Construction: Rectangular; Technology: THICK FILM; Length: 1mm; Width: 0.5mm; Height: 0.32mm; Depth: 0.5mm; Reach SVHC Compliant: Yes; Lead Free: Lead Free; RoHS Compliant: Yes; Military Standard: Not; ComponentLink1URL: https://datasheet.ciiva.com/11819/0900766b80c66297-11819477.pdf?src-supplier=RSComponents; ComponentLink1Description: https://datasheet.ciiva.com/11819/0900766b80c66297-11819477.pdf?src-supplier=RSComponents; ComponentLink2URL: https://datasheet.ciiva.com/7983/1018594-7983502.pdf?src-supplier=Element14; ComponentLink2Description: https://datasheet.ciiva.com/7983/1018594-7983502.pdf?src-supplier=Element14; ComponentLink3URL: https://datasheet.ciiva.com/22747/1018594-22747513.pdf?src-supplier=Element14; ComponentLink3Description: https://datasheet.ciiva.com/22747/1018594-22747513.pdf?src-supplier=Element14; ComponentLink4URL: https://datasheet.ciiva.com/12666/pyu-rc0402-51-rohs-l-6-r-12666741.pdf?src-supplier=Mouser; ComponentLink4Description: https://datasheet.ciiva.com/12666/pyu-rc0402-51-rohs-l-6-r-12666741.pdf?src-supplier=Mouser; ComponentLink5URL: https://datasheet.ciiva.com/7849/1018594-7849869.pdf?src-supplier=Element14; ComponentLink5Description: https://datasheet.ciiva.com/7849/1018594-7849869.pdf?src-supplier=Element14; ComponentLink6URL: https://datasheet.ciiva.com/7849/1018594-7849871.pdf?src-supplier=Element14; ComponentLink6Description: https://datasheet.ciiva.com/7849/1018594-7849871.pdf?src-supplier=Element14; ComponentLink7URL: https://datasheet.ciiva.com/17063/pyu-rc0402-51-rohs-l-6-r-17063193.pdf?src-supplier=Future+Electronics; ComponentLink7Description: https://datasheet.ciiva.com/17063/pyu-rc0402-51-rohs-l-6-r-17063193.pdf?src-supplier=Future+Electronics; Supplier Part Number 1: 311-1.00KLRCT-ND
SB6 = Solder Bridge: Solder Bridge ON
U10 = RK3588: as U10 on sheet RK3588-OSC-PLL-PMUIO; LCSC Part Number: *; Item Type: IC

## Sheet RK3588-MIPI-Interface.SchDoc
size 420 x 297 mm; SheetNumber: 10; SheetTotal: 22
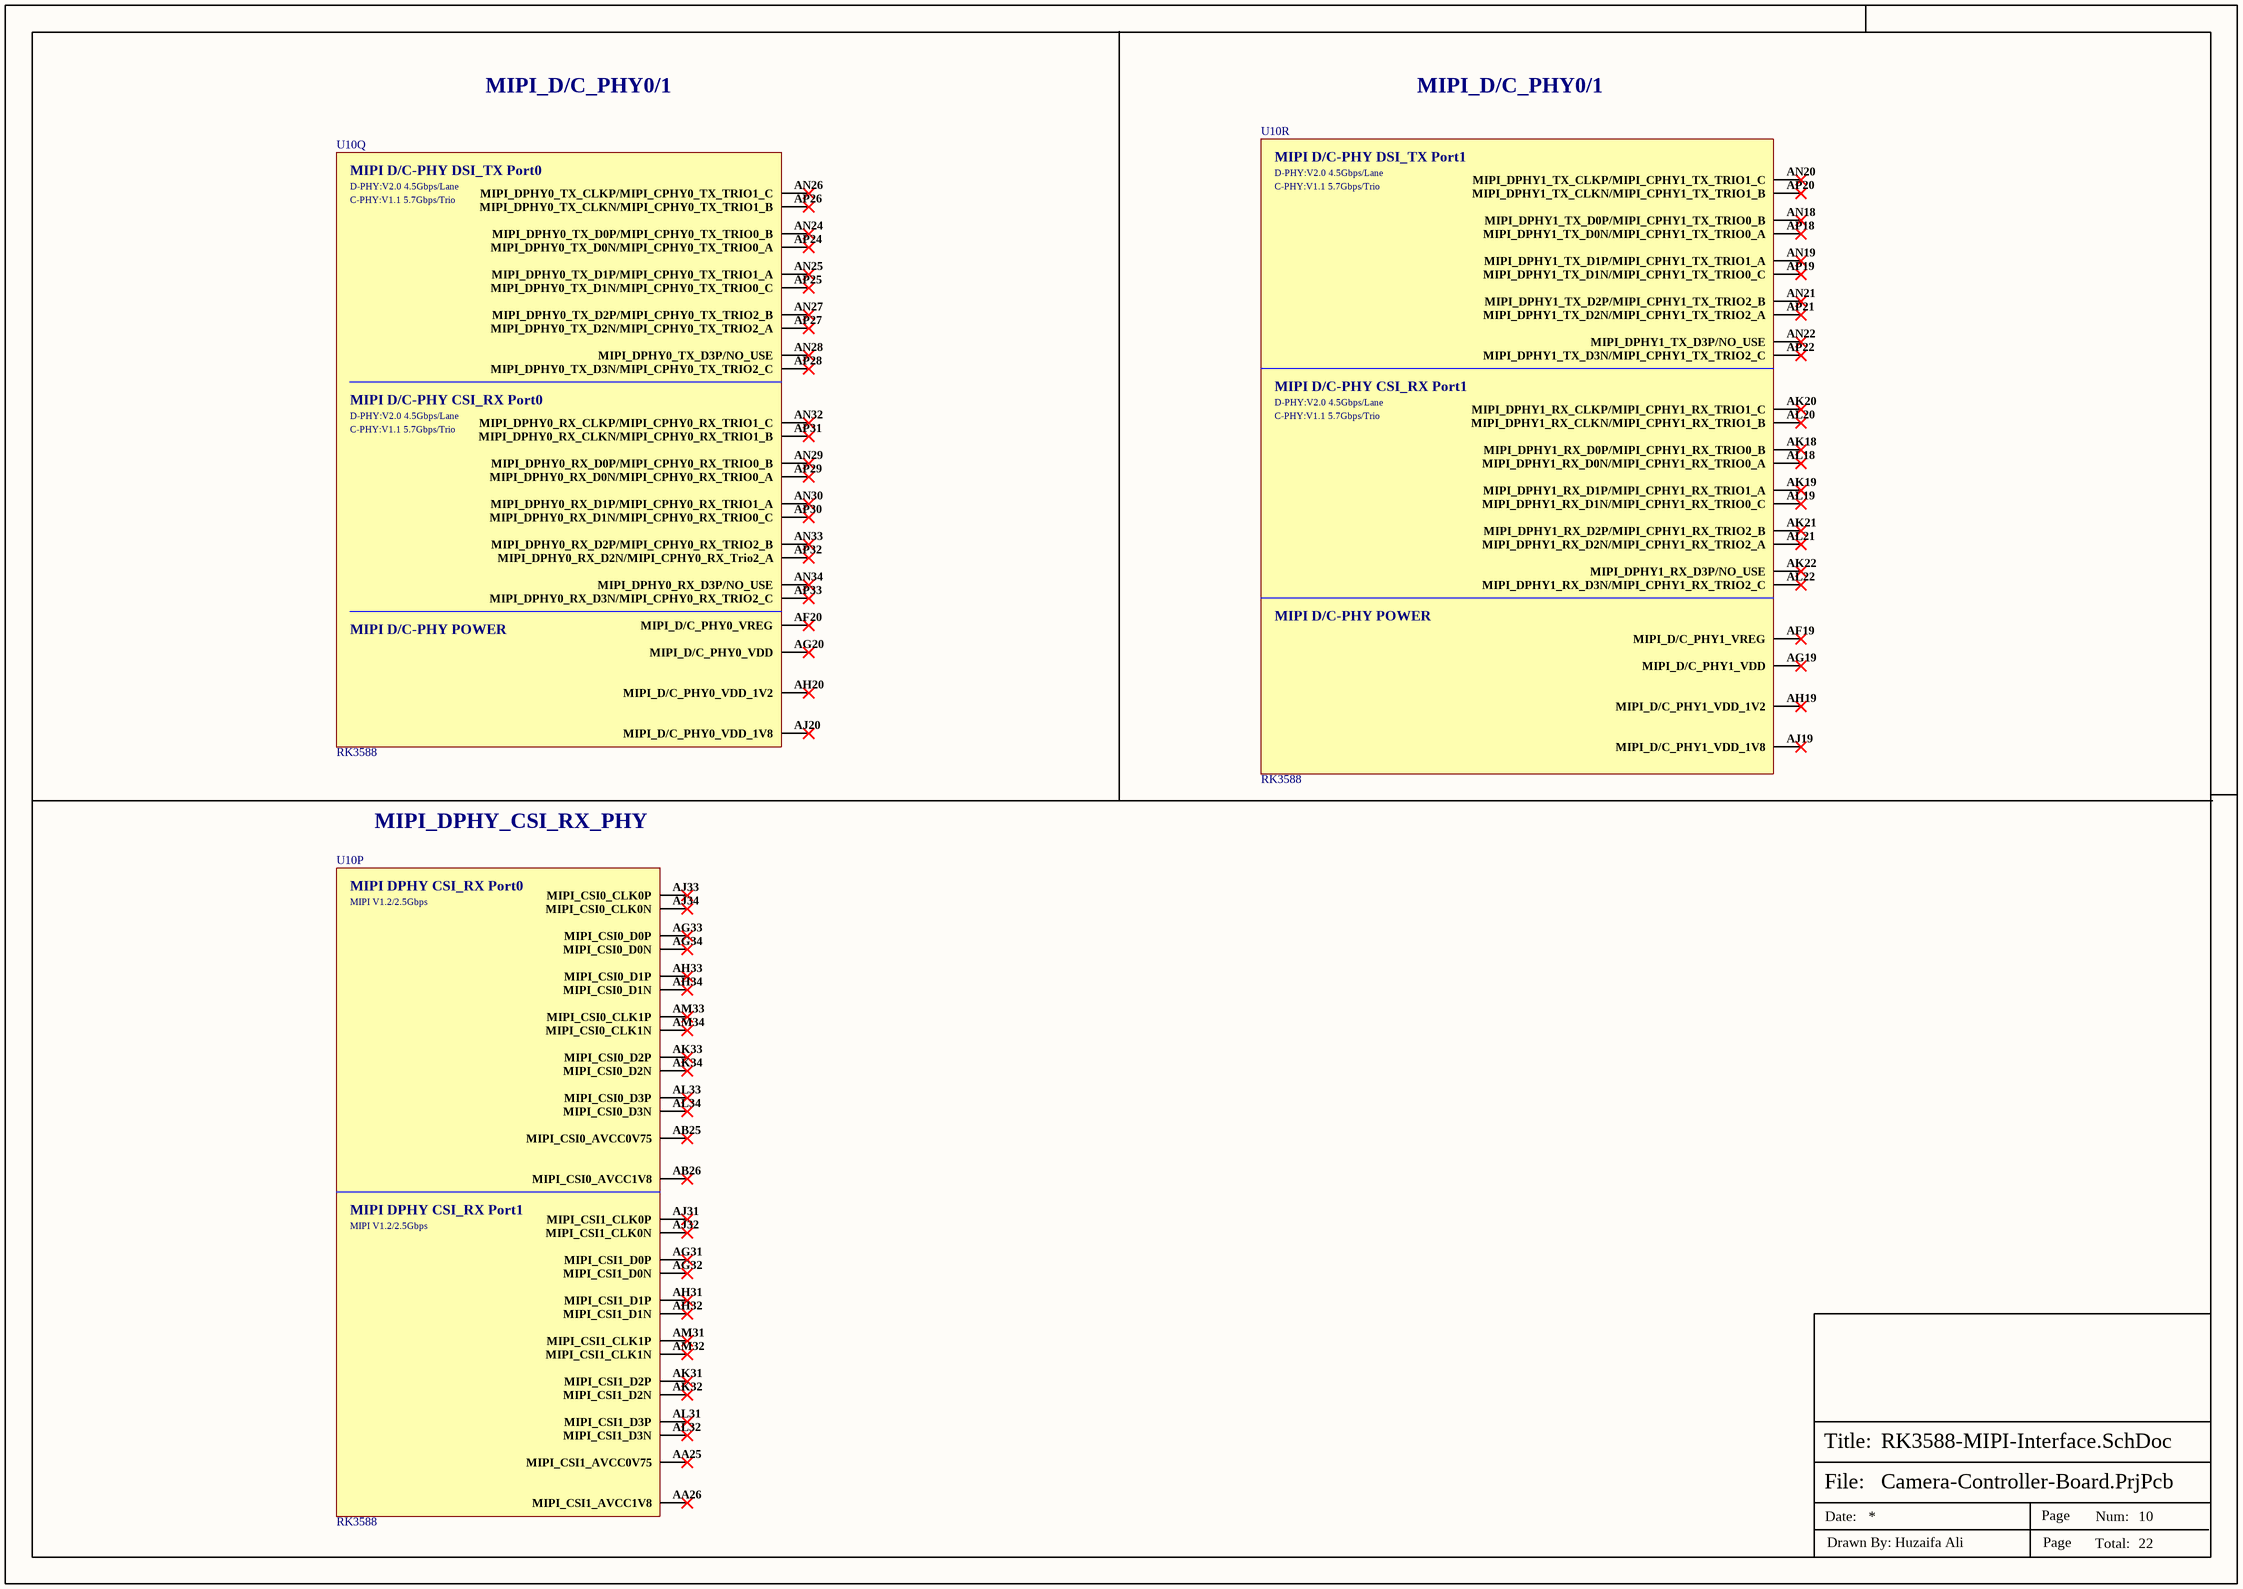
[diagram p9: RK3588-MIPI-Interface.SchDoc]

### Parts
U10  RK3588  [FCBGA-1088L]  (parts P,Q,R of 26)

### Nets

Not connected (* = marked no-connect by the designer): U10 AA25(MIPI_CSI1_AVCC0V75)* AA26(MIPI_CSI1_AVCC1V8)* AB25(MIPI_CSI0_AVCC0V75)* AB26(MIPI_CSI0_AVCC1V8)* AF19(MIPI_D/C_PHY1_VREG)* AF20(MIPI_D/C_PHY0_VREG)* AG19(MIPI_D/C_PHY1_VDD)* AG20(MIPI_D/C_PHY0_VDD)* AG31(MIPI_CSI1_D0P)* AG32(MIPI_CSI1_D0N)* AG33(MIPI_CSI0_D0P)* AG34(MIPI_CSI0_D0N)* AH19(MIPI_D/C_PHY1_VDD_1V2)* AH20(MIPI_D/C_PHY0_VDD_1V2)* AH31(MIPI_CSI1_D1P)* AH32(MIPI_CSI1_D1N)* AH33(MIPI_CSI0_D1P)* AH34(MIPI_CSI0_D1N)* AJ19(MIPI_D/C_PHY1_VDD_1V8)* AJ20(MIPI_D/C_PHY0_VDD_1V8)* AJ31(MIPI_CSI1_CLK0P)* AJ32(MIPI_CSI1_CLK0N)* AJ33(MIPI_CSI0_CLK0P)* AJ34(MIPI_CSI0_CLK0N)* AK18(MIPI_DPHY1_RX_D0P/MIPI_CPHY1_RX_TRIO0_B)* AK19(MIPI_DPHY1_RX_D1P/MIPI_CPHY1_RX_TRIO1_A)* AK20(MIPI_DPHY1_RX_CLKP/MIPI_CPHY1_RX_TRIO1_C)* AK21(MIPI_DPHY1_RX_D2P/MIPI_CPHY1_RX_TRIO2_B)* AK22(MIPI_DPHY1_RX_D3P/NO_USE)* AK31(MIPI_CSI1_D2P)* AK32(MIPI_CSI1_D2N)* AK33(MIPI_CSI0_D2P)* AK34(MIPI_CSI0_D2N)* AL18(MIPI_DPHY1_RX_D0N/MIPI_CPHY1_RX_TRIO0_A)* AL19(MIPI_DPHY1_RX_D1N/MIPI_CPHY1_RX_TRIO0_C)* AL20(MIPI_DPHY1_RX_CLKN/MIPI_CPHY1_RX_TRIO1_B)* AL21(MIPI_DPHY1_RX_D2N/MIPI_CPHY1_RX_TRIO2_A)* AL22(MIPI_DPHY1_RX_D3N/MIPI_CPHY1_RX_TRIO2_C)* AL31(MIPI_CSI1_D3P)* AL32(MIPI_CSI1_D3N)* AL33(MIPI_CSI0_D3P)* AL34(MIPI_CSI0_D3N)* AM31(MIPI_CSI1_CLK1P)* AM32(MIPI_CSI1_CLK1N)* AM33(MIPI_CSI0_CLK1P)* AM34(MIPI_CSI0_CLK1N)* AN18(MIPI_DPHY1_TX_D0P/MIPI_CPHY1_TX_TRIO0_B)* AN19(MIPI_DPHY1_TX_D1P/MIPI_CPHY1_TX_TRIO1_A)* AN20(MIPI_DPHY1_TX_CLKP/MIPI_CPHY1_TX_TRIO1_C)* AN21(MIPI_DPHY1_TX_D2P/MIPI_CPHY1_TX_TRIO2_B)* AN22(MIPI_DPHY1_TX_D3P/NO_USE)* AN24(MIPI_DPHY0_TX_D0P/MIPI_CPHY0_TX_TRIO0_B)* AN25(MIPI_DPHY0_TX_D1P/MIPI_CPHY0_TX_TRIO1_A)* AN26(MIPI_DPHY0_TX_CLKP/MIPI_CPHY0_TX_TRIO1_C)* AN27(MIPI_DPHY0_TX_D2P/MIPI_CPHY0_TX_TRIO2_B)* AN28(MIPI_DPHY0_TX_D3P/NO_USE)* AN29(MIPI_DPHY0_RX_D0P/MIPI_CPHY0_RX_TRIO0_B)* AN30(MIPI_DPHY0_RX_D1P/MIPI_CPHY0_RX_TRIO1_A)* AN32(MIPI_DPHY0_RX_CLKP/MIPI_CPHY0_RX_TRIO1_C)* AN33(MIPI_DPHY0_RX_D2P/MIPI_CPHY0_RX_TRIO2_B)* AN34(MIPI_DPHY0_RX_D3P/NO_USE)* AP18(MIPI_DPHY1_TX_D0N/MIPI_CPHY1_TX_TRIO0_A)* AP19(MIPI_DPHY1_TX_D1N/MIPI_CPHY1_TX_TRIO0_C)* AP20(MIPI_DPHY1_TX_CLKN/MIPI_CPHY1_TX_TRIO1_B)* AP21(MIPI_DPHY1_TX_D2N/MIPI_CPHY1_TX_TRIO2_A)* AP22(MIPI_DPHY1_TX_D3N/MIPI_CPHY1_TX_TRIO2_C)* AP24(MIPI_DPHY0_TX_D0N/MIPI_CPHY0_TX_TRIO0_A)* AP25(MIPI_DPHY0_TX_D1N/MIPI_CPHY0_TX_TRIO0_C)* AP26(MIPI_DPHY0_TX_CLKN/MIPI_CPHY0_TX_TRIO1_B)* AP27(MIPI_DPHY0_TX_D2N/MIPI_CPHY0_TX_TRIO2_A)* AP28(MIPI_DPHY0_TX_D3N/MIPI_CPHY0_TX_TRIO2_C)* AP29(MIPI_DPHY0_RX_D0N/MIPI_CPHY0_RX_TRIO0_A)* AP30(MIPI_DPHY0_RX_D1N/MIPI_CPHY0_RX_TRIO0_C)* AP31(MIPI_DPHY0_RX_CLKN/MIPI_CPHY0_RX_TRIO1_B)* AP32(MIPI_DPHY0_RX_D2N/MIPI_CPHY0_RX_Trio2_A)* AP33(MIPI_DPHY0_RX_D3N/MIPI_CPHY0_RX_TRIO2_C)*

### Notes on the sheet
- MIPI_D/C_PHY0/1
- MIPI_DPHY_CSI_RX_PHY
- File:
- Title:
- Date:
- Page
- Num:
- Total:
- Drawn By: Huzaifa Ali
- (in symbol RK3588, part P) MIPI DPHY CSI_RX Port0; MIPI V1.2/2.5Gbps; MIPI DPHY CSI_RX Port1
- (in symbol RK3588, part Q) MIPI D/C-PHY DSI_TX Port0; D-PHY:V2.0 4.5Gbps/Lane; C-PHY:V1.1 5.7Gbps/Trio; MIPI D/C-PHY CSI_RX Port0; MIPI D/C-PHY POWER
- (in symbol RK3588, part R) MIPI D/C-PHY DSI_TX Port1; D-PHY:V2.0 4.5Gbps/Lane; C-PHY:V1.1 5.7Gbps/Trio; MIPI D/C-PHY CSI_RX Port1; MIPI D/C-PHY POWER

### Library data of the parts
U10 = RK3588: as U10 on sheet RK3588-OSC-PLL-PMUIO; LCSC Part Number: *; Item Type: IC

## Sheet RK3588-HDMI.SchDoc
size 420 x 297 mm; SheetNumber: 11; SheetTotal: 22
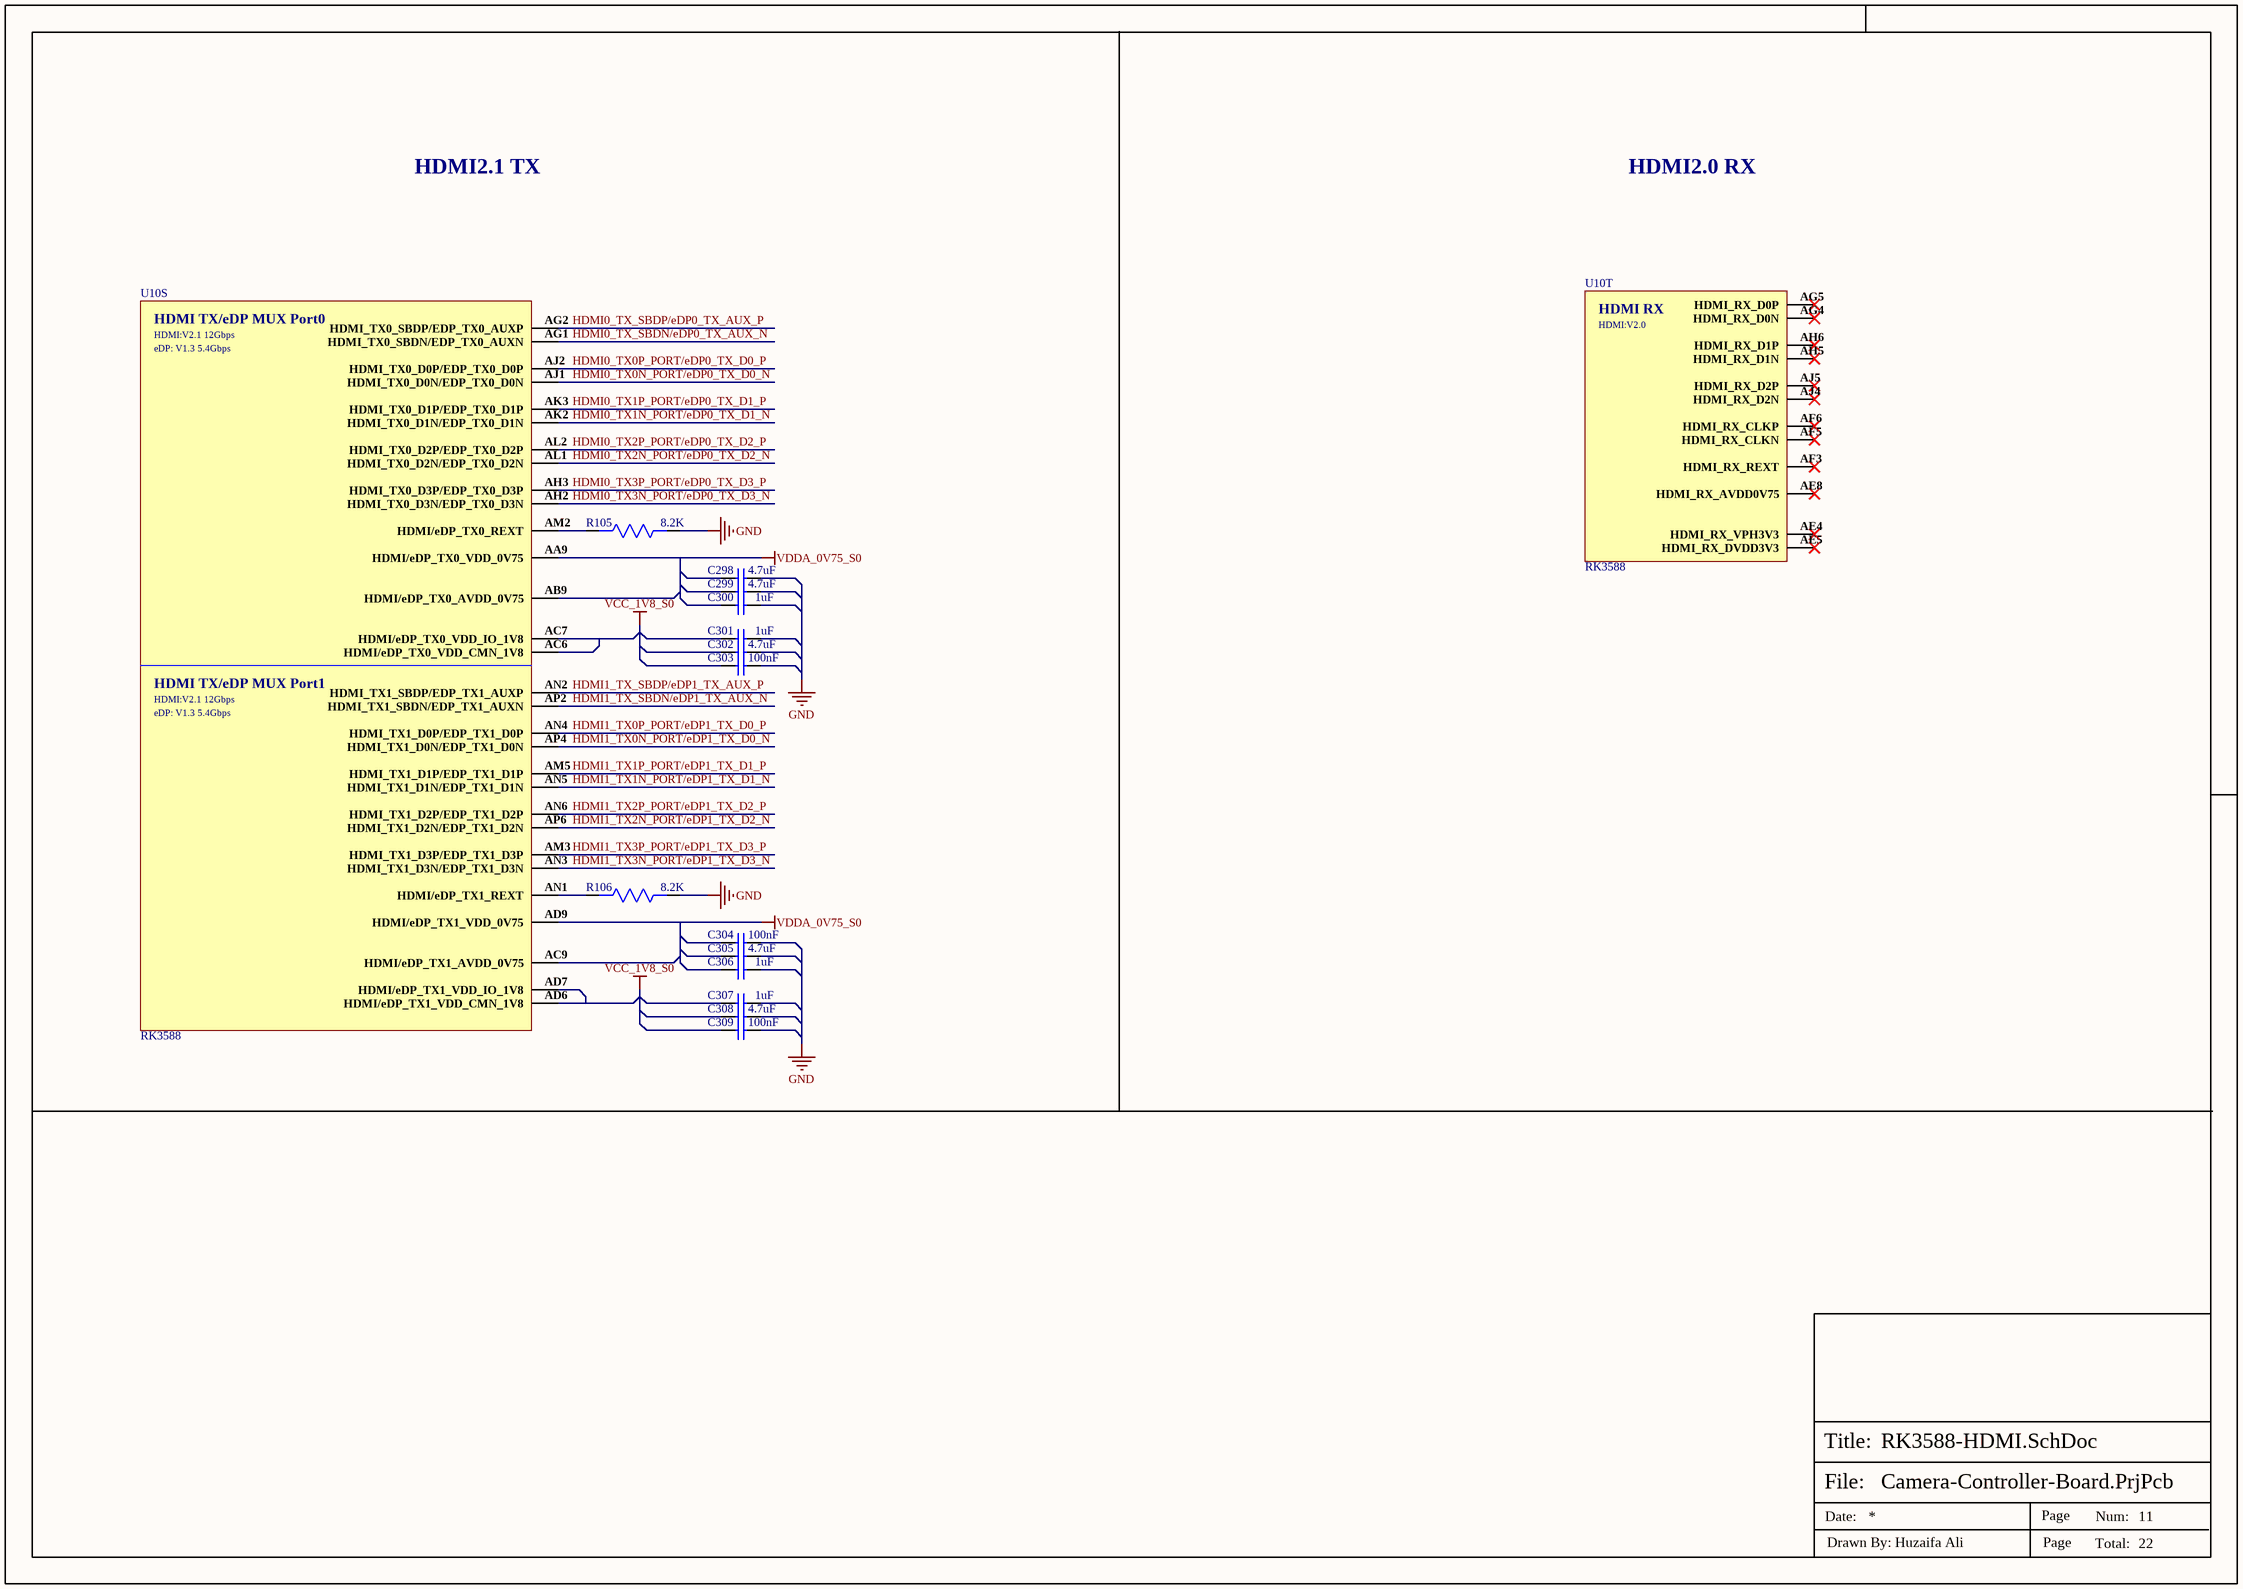
[diagram p10: RK3588-HDMI.SchDoc]

### Parts
C298  4.7uF  [Cap-0402]
C299  4.7uF  [Cap-0402]
C300  1uF  [CAP-0201]
C301  1uF  [CAP-0201]
C302  4.7uF  [Cap-0402]
C303  100nF  [CAP-0201]
C304  100nF  [CAP-0201]
C305  4.7uF  [Cap-0402]
C306  1uF  [CAP-0201]
C307  1uF  [CAP-0201]
C308  4.7uF  [Cap-0402]
C309  100nF  [CAP-0201]
R105  8.2K  [Res-0201]
R106  8.2K  [Res-0201]
U10  RK3588  [FCBGA-1088L]  (parts S,T of 26)

### Nets
GND: C298.2 C299.2 C300.2 C301.2 C302.2 C303.2 C304.2 C305.2 C306.2 C307.2 C308.2 C309.2 R105.1 R106.1
VCC_1V8_S0: C301.1 C302.1 C303.1 C307.1 C308.1 C309.1 U10.AC6(HDMI/eDP_TX0_VDD_CMN_1V8) U10.AC7(HDMI/eDP_TX0_VDD_IO_1V8) U10.AD6(HDMI/eDP_TX1_VDD_CMN_1V8) U10.AD7(HDMI/eDP_TX1_VDD_IO_1V8)
VDDA_0V75_S0: C298.1 C299.1 C300.1 C304.1 C305.1 C306.1 U10.AA9(HDMI/eDP_TX0_VDD_0V75) U10.AB9(HDMI/eDP_TX0_AVDD_0V75) U10.AC9(HDMI/eDP_TX1_AVDD_0V75) U10.AD9(HDMI/eDP_TX1_VDD_0V75)
HDMI0_TX0N_PORT/eDP0_TX_D0_N: U10.AJ1(HDMI_TX0_D0N/EDP_TX0_D0N)
HDMI0_TX0P_PORT/eDP0_TX_D0_P: U10.AJ2(HDMI_TX0_D0P/EDP_TX0_D0P)
HDMI0_TX1N_PORT/eDP0_TX_D1_N: U10.AK2(HDMI_TX0_D1N/EDP_TX0_D1N)
HDMI0_TX1P_PORT/eDP0_TX_D1_P: U10.AK3(HDMI_TX0_D1P/EDP_TX0_D1P)
HDMI0_TX2N_PORT/eDP0_TX_D2_N: U10.AL1(HDMI_TX0_D2N/EDP_TX0_D2N)
HDMI0_TX2P_PORT/eDP0_TX_D2_P: U10.AL2(HDMI_TX0_D2P/EDP_TX0_D2P)
HDMI0_TX3N_PORT/eDP0_TX_D3_N: U10.AH2(HDMI_TX0_D3N/EDP_TX0_D3N)
HDMI0_TX3P_PORT/eDP0_TX_D3_P: U10.AH3(HDMI_TX0_D3P/EDP_TX0_D3P)
HDMI0_TX_SBDN/eDP0_TX_AUX_N: U10.AG1(HDMI_TX0_SBDN/EDP_TX0_AUXN)
HDMI0_TX_SBDP/eDP0_TX_AUX_P: U10.AG2(HDMI_TX0_SBDP/EDP_TX0_AUXP)
HDMI1_TX0N_PORT/eDP1_TX_D0_N: U10.AP4(HDMI_TX1_D0N/EDP_TX1_D0N)
HDMI1_TX0P_PORT/eDP1_TX_D0_P: U10.AN4(HDMI_TX1_D0P/EDP_TX1_D0P)
HDMI1_TX1N_PORT/eDP1_TX_D1_N: U10.AN5(HDMI_TX1_D1N/EDP_TX1_D1N)
HDMI1_TX1P_PORT/eDP1_TX_D1_P: U10.AM5(HDMI_TX1_D1P/EDP_TX1_D1P)
HDMI1_TX2N_PORT/eDP1_TX_D2_N: U10.AP6(HDMI_TX1_D2N/EDP_TX1_D2N)
HDMI1_TX2P_PORT/eDP1_TX_D2_P: U10.AN6(HDMI_TX1_D2P/EDP_TX1_D2P)
HDMI1_TX3N_PORT/eDP1_TX_D3_N: U10.AN3(HDMI_TX1_D3N/EDP_TX1_D3N)
HDMI1_TX3P_PORT/eDP1_TX_D3_P: U10.AM3(HDMI_TX1_D3P/EDP_TX1_D3P)
HDMI1_TX_SBDN/eDP1_TX_AUX_N: U10.AP2(HDMI_TX1_SBDN/EDP_TX1_AUXN)
HDMI1_TX_SBDP/eDP1_TX_AUX_P: U10.AN2(HDMI_TX1_SBDP/EDP_TX1_AUXP)
NetR105_2: R105.2 U10.AM2(HDMI/eDP_TX0_REXT)
NetR106_2: R106.2 U10.AN1(HDMI/eDP_TX1_REXT)

Not connected (* = marked no-connect by the designer): U10 AE4(HDMI_RX_VPH3V3)* AE5(HDMI_RX_DVDD3V3)* AE8(HDMI_RX_AVDD0V75)* AF3(HDMI_RX_REXT)* AF5(HDMI_RX_CLKN)* AF6(HDMI_RX_CLKP)* AG4(HDMI_RX_D0N)* AG5(HDMI_RX_D0P)* AH5(HDMI_RX_D1N)* AH6(HDMI_RX_D1P)* AJ4(HDMI_RX_D2N)* AJ5(HDMI_RX_D2P)*

### Notes on the sheet
- HDMI2.1 TX
- HDMI2.0 RX
- File:
- Title:
- Date:
- Page
- Num:
- Total:
- Drawn By: Huzaifa Ali
- (in symbol RK3588, part S) HDMI TX/eDP MUX Port0; HDMI:V2.1 12Gbps; eDP: V1.3 5.4Gbps; HDMI TX/eDP MUX Port1
- (in symbol RK3588, part T) HDMI RX; HDMI:V2.0

### Library data of the parts
C298 C299 C302 C305 C308 = CC0402KRX5R6BB475: CAP CER 4.7UF 10V X5R 0402; Manufacturer: Yageo; Tolerance: 10%; Supplier 1: Farnell; Manufacturer Part Number: CC0402KRX5R6BB475; RoHS: Yes; Category: Ceramic Capacitors; Stock 1: 20000; Pricing 1: 10000=0.02310, 50000=0.02100 (GBP); Mount: Surface Mount; Case/Package: 0402; Case Code (Imperial): 0402; Case Code (Metric): 1005; Min Operating Temperature: -55°C; Max Operating Temperature: 85°C; Packaging: Cut Tape; Capacitance: 4.7uF; Voltage Rating: 10V; RoHS Compliant: Yes; ComponentLink1URL: http://www.yageo.com/documents/recent/UPY-GPHC_X5R_4V-to-50V_25.pdf?src-supplier=Digi-Key; ComponentLink1Description: http://www.yageo.com/documents/recent/UPY-GPHC_X5R_4V-to-50V_25.pdf?src-supplier=Digi-Key; Supplier Part Number 1: 3871698; LCSC Part Number: C326586
C300 C301 C306 C307 = CC0201KRX5R5BB105: as C230 on sheet RK3588-OSC-PLL-PMUIO; Supplier 1: Digi-Key; Manufacturer Part Number: CC0201KRX5R5BB105; RoHS: Yes; Category: Ceramic Capacitors; Stock 1: 1909543; Pricing 1: 1=0.10000, 10=0.04600, 50=0.02500, 100=0.02050, 500=0.01464, 1000=0.01150, 2500=0.01045, 5000=0.00962 (USD); Mount: Surface Mount; Case/Package: 0201; Case Code (Imperial): 0201; Case Code (Metric): 0603; Min Operating Temperature: -55°C; Max Operating Temperature: 85°C; Packaging: Cut Tape; Capacitance: 1uF; Voltage Rating: 6.3V; RoHS Compliant: Yes; ComponentLink1URL: http://www.yageo.com/documents/recent/UPY-GPHC_X5R_4V-to-50V_25.pdf?src-supplier=Digi-Key; ComponentLink1Description: http://www.yageo.com/documents/recent/UPY-GPHC_X5R_4V-to-50V_25.pdf?src-supplier=Digi-Key; ComponentLink2URL: https://www.yageo.com/upload/media/product/productsearch/datasheet/mlcc/UPY-GPHC_X5R_4V-to-50V_26.pdf?src-supplier=Digi-Key; ComponentLink2Description: https://www.yageo.com/upload/media/product/productsearch/datasheet/mlcc/UPY-GPHC_X5R_4V-to-50V_26.pdf?src-supplier=Digi-Key; Supplier Part Number 1: 311-3471-1-ND
C303 C309 = CC0201KRX5R5BB104: as C244 on sheet RK3588-OSC-PLL-PMUIO; Supplier 1: Digi-Key; Manufacturer Part Number: CC0201KRX5R5BB104; RoHS: Yes; Category: Ceramic Capacitors; Stock 1: 3711589; Pricing 1: 1=0.10000, 10=0.02100, 50=0.01160, 100=0.00960, 500=0.00682, 1000=0.00536, 2500=0.00487, 5000=0.00448 (USD); Mount: Surface Mount; Case/Package: 0201; Number of Pins: 2; Case Code (Imperial): 0201; Case Code (Metric): 0603; Min Operating Temperature: -55°C; Max Operating Temperature: 85°C; Capacitance: 100nF; Dielectric: X5R; Voltage Rating: 6.3V; Packaging: Tape and Reel; Package Quantity: 1; Voltage Rating (DC): 6.3V; Termination: SMD/SMT; Resistor Type: Ceramic; Series: CC; Length: 0.6mm; Width: 0.012inch; Height: 0.3mm; Thickness: 0.013inch; Depth: 0.3mm; Reach SVHC Compliant: Yes; Lead Free: Lead Free; Halogen Free: Halogen Free; RoHS Compliant: Yes; ComponentLink1URL: https://datasheet.ciiva.com/7656/1525783-7656597.pdf?src-supplier=Element14; ComponentLink1Description: https://datasheet.ciiva.com/7656/1525783-7656597.pdf?src-supplier=Element14; ComponentLink2URL: https://datasheet.ciiva.com/28450/1359354-28450200.pdf?src-supplier=Element14; ComponentLink2Description: https://datasheet.ciiva.com/28450/1359354-28450200.pdf?src-supplier=Element14; ComponentLink3URL: https://datasheet.ciiva.com/176/mlccorderingcode-176766.pdf?src-supplier=Digi-Key; ComponentLink3Description: https://datasheet.ciiva.com/176/mlccorderingcode-176766.pdf?src-supplier=Digi-Key; ComponentLink4URL: https://datasheet.ciiva.com/176/mlccorderingcode-176765.pdf?src-supplier=Digi-Key; ComponentLink4Description: https://datasheet.ciiva.com/176/mlccorderingcode-176765.pdf?src-supplier=Digi-Key; ComponentLink5URL: https://datasheet.ciiva.com/176/mlccorderingcode-176767.pdf?src-supplier=Digi-Key; ComponentLink5Description: https://datasheet.ciiva.com/176/mlccorderingcode-176767.pdf?src-supplier=Digi-Key; Supplier Part Number 1: 311-1408-1-ND
C304 = CC0201KRX5R6BB104: as C232-C237 on sheet RK3588-OSC-PLL-PMUIO; Supplier 1: Mouser; Manufacturer Part Number: CC0201KRX5R6BB104; RoHS: Yes; Category: Ceramic Capacitors; Stock 1: 824403; Pricing 1: 1=0.10000, 10=0.02400, 50=0.02400, 100=0.01900, 1000=0.01100, 10000=0.00900 (USD); Mount: Surface Mount; Case/Package: 0201; Case Code (Imperial): 0201; Case Code (Metric): 0603; Weight: 6E-06oz; Min Operating Temperature: -55°C; Max Operating Temperature: 85°C; Capacitance: 100nF; Dielectric: X5R; Voltage Rating (DC): 10V; Packaging: Tape and Reel; Termination: SMD/SMT; Resistor Type: Ceramic; Voltage Rating: 10V; Series: CC; Construction: Flat; Length: 0.6mm; Width: 0.012inch; Height: 0.3mm; Thickness: 0.013inch; Depth: 0.3mm; Radiation Hardening: No; Lead Free: Lead Free; Halogen Free: Halogen Free; RoHS Compliant: Yes; ComponentLink1URL: https://datasheet.ciiva.com/11587/upy-gphc-x5r-4v-to-50v-12-11587190.pdf?src-supplier=Avnet; ComponentLink1Description: https://datasheet.ciiva.com/11587/upy-gphc-x5r-4v-to-50v-12-11587190.pdf?src-supplier=Avnet; Supplier Part Number 1: 603-CC201KRX5R6BB104; LCSC Part Number: C190183
R105 R106 = RC0201FR-078K2L: as R89 on sheet RK3588-USB-Control; Supplier 1: Digi-Key; Manufacturer Part Number: RC0201FR-078K2L; RoHS: Yes; Category: Chip SMD Resistors; Stock 1: 282340; Pricing 1: 1=0.10000, 10=0.03700, 100=0.01500, 1000=0.00672, 2500=0.00583, 5000=0.00482 (USD); Case/Package: 0201; Case Code (Metric): 0603; Case Code (Imperial): 0201; Min Operating Temperature: -55°C; Max Operating Temperature: 125°C; Package Quantity: 10000; Packaging: Tape and Reel; Tolerance: 1%; Resistor Type: Thick Film; Number of Terminations: 2; Termination: SMD/SMT; Max Power Dissipation: 50mW; Features: Moisture Resistant; Series: RC; Resistance Tolerance: 1%; Length: 0.024inch; Width: 0.3mm; Height: 0.01inch; Reach SVHC Compliant: Yes; Lead Free: Lead Free; RoHS Compliant: Yes; ComponentLink1URL: https://datasheet.ciiva.com/14985/pyu-r-int-thick-7-14985436.pdf?src-supplier=Digi-Key; ComponentLink1Description: https://datasheet.ciiva.com/14985/pyu-r-int-thick-7-14985436.pdf?src-supplier=Digi-Key; Supplier Part Number 1: YAG2353CT-ND
U10 = RK3588: as U10 on sheet RK3588-OSC-PLL-PMUIO; LCSC Part Number: *; Item Type: IC

## Sheet RK3588-PCIE-SATA.SchDoc
size 420 x 297 mm; SheetNumber: 12; SheetTotal: 22
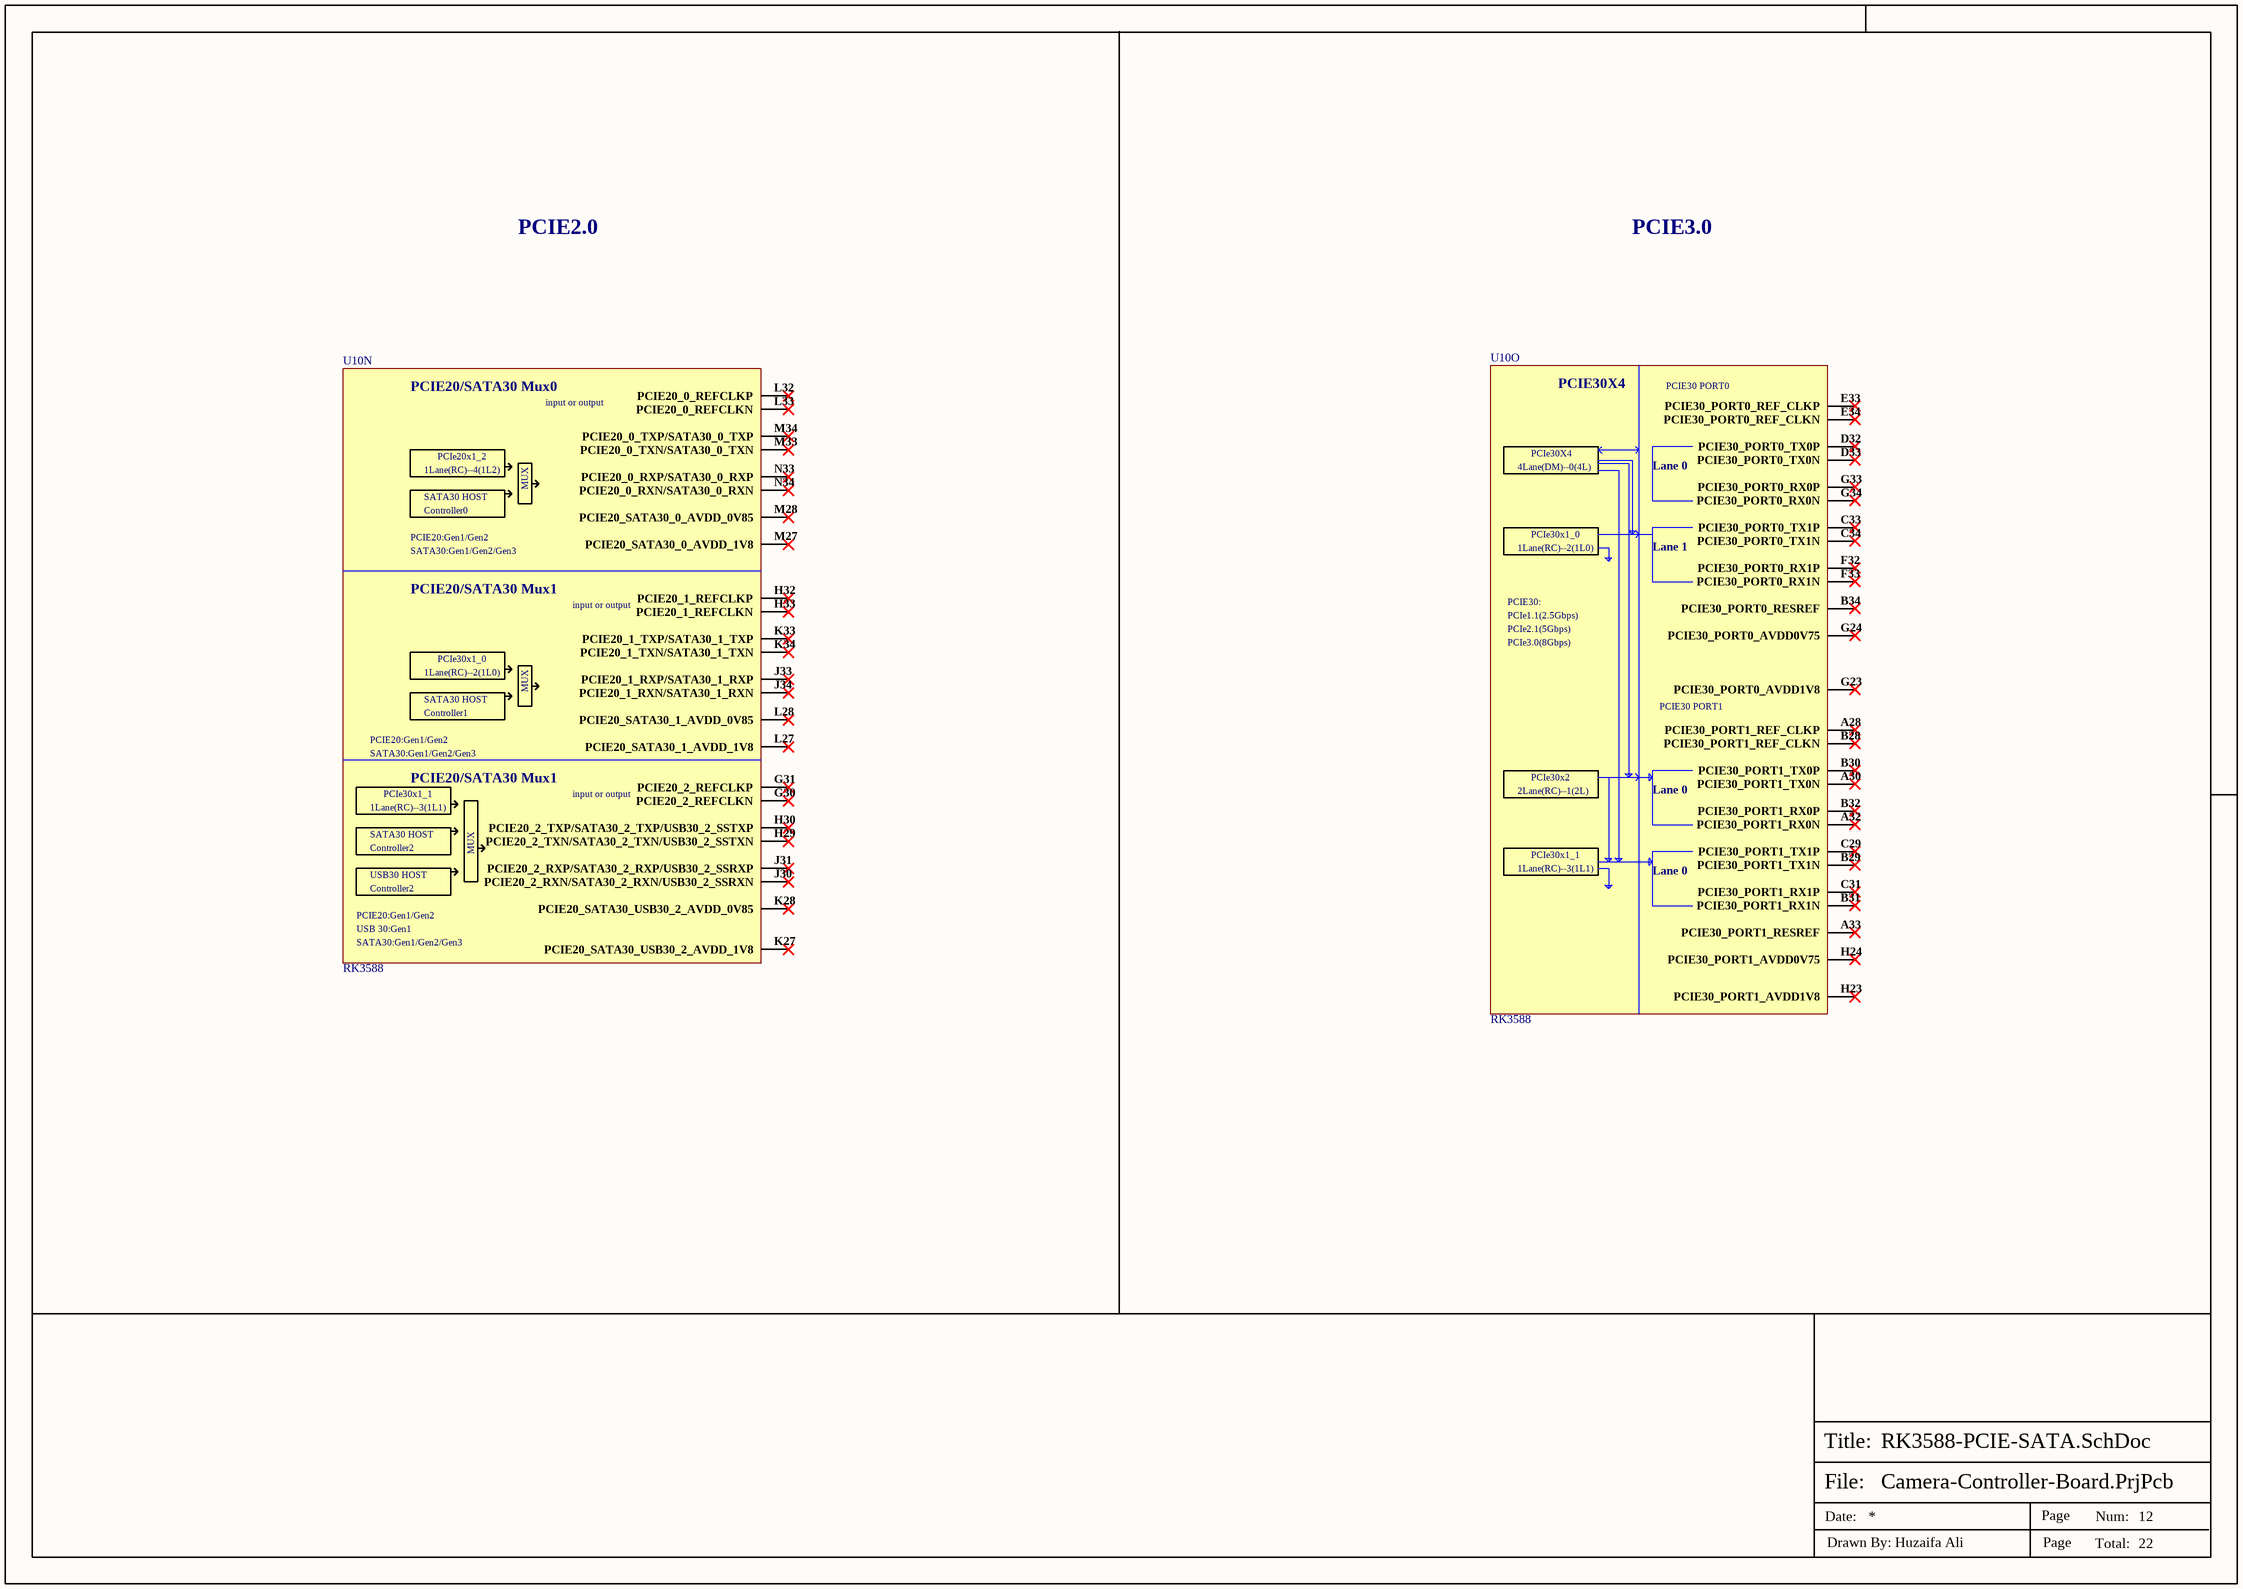
[diagram p11: RK3588-PCIE-SATA.SchDoc]

### Parts
U10  RK3588  [FCBGA-1088L]  (parts N,O of 26)

### Nets

Not connected (* = marked no-connect by the designer): U10 A28(PCIE30_PORT1_REF_CLKP)* A30(PCIE30_PORT1_TX0N)* A32(PCIE30_PORT1_RX0N)* A33(PCIE30_PORT1_RESREF)* B28(PCIE30_PORT1_REF_CLKN)* B29(PCIE30_PORT1_TX1N)* B30(PCIE30_PORT1_TX0P)* B31(PCIE30_PORT1_RX1N)* B32(PCIE30_PORT1_RX0P)* B34(PCIE30_PORT0_RESREF)* C29(PCIE30_PORT1_TX1P)* C31(PCIE30_PORT1_RX1P)* C33(PCIE30_PORT0_TX1P)* C34(PCIE30_PORT0_TX1N)* D32(PCIE30_PORT0_TX0P)* D33(PCIE30_PORT0_TX0N)* E33(PCIE30_PORT0_REF_CLKP)* E34(PCIE30_PORT0_REF_CLKN)* F32(PCIE30_PORT0_RX1P)* F33(PCIE30_PORT0_RX1N)* G23(PCIE30_PORT0_AVDD1V8)* G24(PCIE30_PORT0_AVDD0V75)* G30(PCIE20_2_REFCLKN)* G31(PCIE20_2_REFCLKP)* G33(PCIE30_PORT0_RX0P)* G34(PCIE30_PORT0_RX0N)* H23(PCIE30_PORT1_AVDD1V8)* H24(PCIE30_PORT1_AVDD0V75)* H29(PCIE20_2_TXN/SATA30_2_TXN/USB30_2_SSTXN)* H30(PCIE20_2_TXP/SATA30_2_TXP/USB30_2_SSTXP)* H32(PCIE20_1_REFCLKP)* H33(PCIE20_1_REFCLKN)* J30(PCIE20_2_RXN/SATA30_2_RXN/USB30_2_SSRXN)* J31(PCIE20_2_RXP/SATA30_2_RXP/USB30_2_SSRXP)* J33(PCIE20_1_RXP/SATA30_1_RXP)* J34(PCIE20_1_RXN/SATA30_1_RXN)* K27(PCIE20_SATA30_USB30_2_AVDD_1V8)* K28(PCIE20_SATA30_USB30_2_AVDD_0V85)* K33(PCIE20_1_TXP/SATA30_1_TXP)* K34(PCIE20_1_TXN/SATA30_1_TXN)* L27(PCIE20_SATA30_1_AVDD_1V8)* L28(PCIE20_SATA30_1_AVDD_0V85)* L32(PCIE20_0_REFCLKP)* L33(PCIE20_0_REFCLKN)* M27(PCIE20_SATA30_0_AVDD_1V8)* M28(PCIE20_SATA30_0_AVDD_0V85)* M33(PCIE20_0_TXN/SATA30_0_TXN)* M34(PCIE20_0_TXP/SATA30_0_TXP)* N33(PCIE20_0_RXP/SATA30_0_RXP)* N34(PCIE20_0_RXN/SATA30_0_RXN)*

### Notes on the sheet
- PCIE2.0
- PCIE3.0
- File:
- Title:
- Date:
- Page
- Num:
- Total:
- Drawn By: Huzaifa Ali
- (in symbol RK3588, part N) PCIE20/SATA30 Mux0; input or output; PCIe20x1_2; 1Lane(RC)--4(1L2); MUX; SATA30 HOST; Controller0; PCIE20:Gen1/Gen2; SATA30:Gen1/Gen2/Gen3; PCIE20/SATA30 Mux1; PCIe30x1_0; 1Lane(RC)--2(1L0); Controller1; PCIe30x1_1; 1Lane(RC)--3(1L1); Controller2; USB30 HOST; USB 30:Gen1
- (in symbol RK3588, part O) PCIE30X4; PCIE30 PORT0; PCIe30X4; 4Lane(DM)--0(4L); Lane 0; PCIe30x1_0; 1Lane(RC)--2(1L0); Lane 1; PCIE30:; PCIe1.1(2.5Gbps); PCIe2.1(5Gbps); PCIe3.0(8Gbps); PCIE30 PORT1; PCIe30x2; 2Lane(RC)--1(2L); PCIe30x1_1; 1Lane(RC)--3(1L1)

### Library data of the parts
U10 = RK3588: as U10 on sheet RK3588-OSC-PLL-PMUIO; LCSC Part Number: *; Item Type: IC